# Altium schematic sheet 基础拓扑推导-1.SchDoc
size 1651 x 1651 mm; SheetNumber: 1; SheetTotal: 16
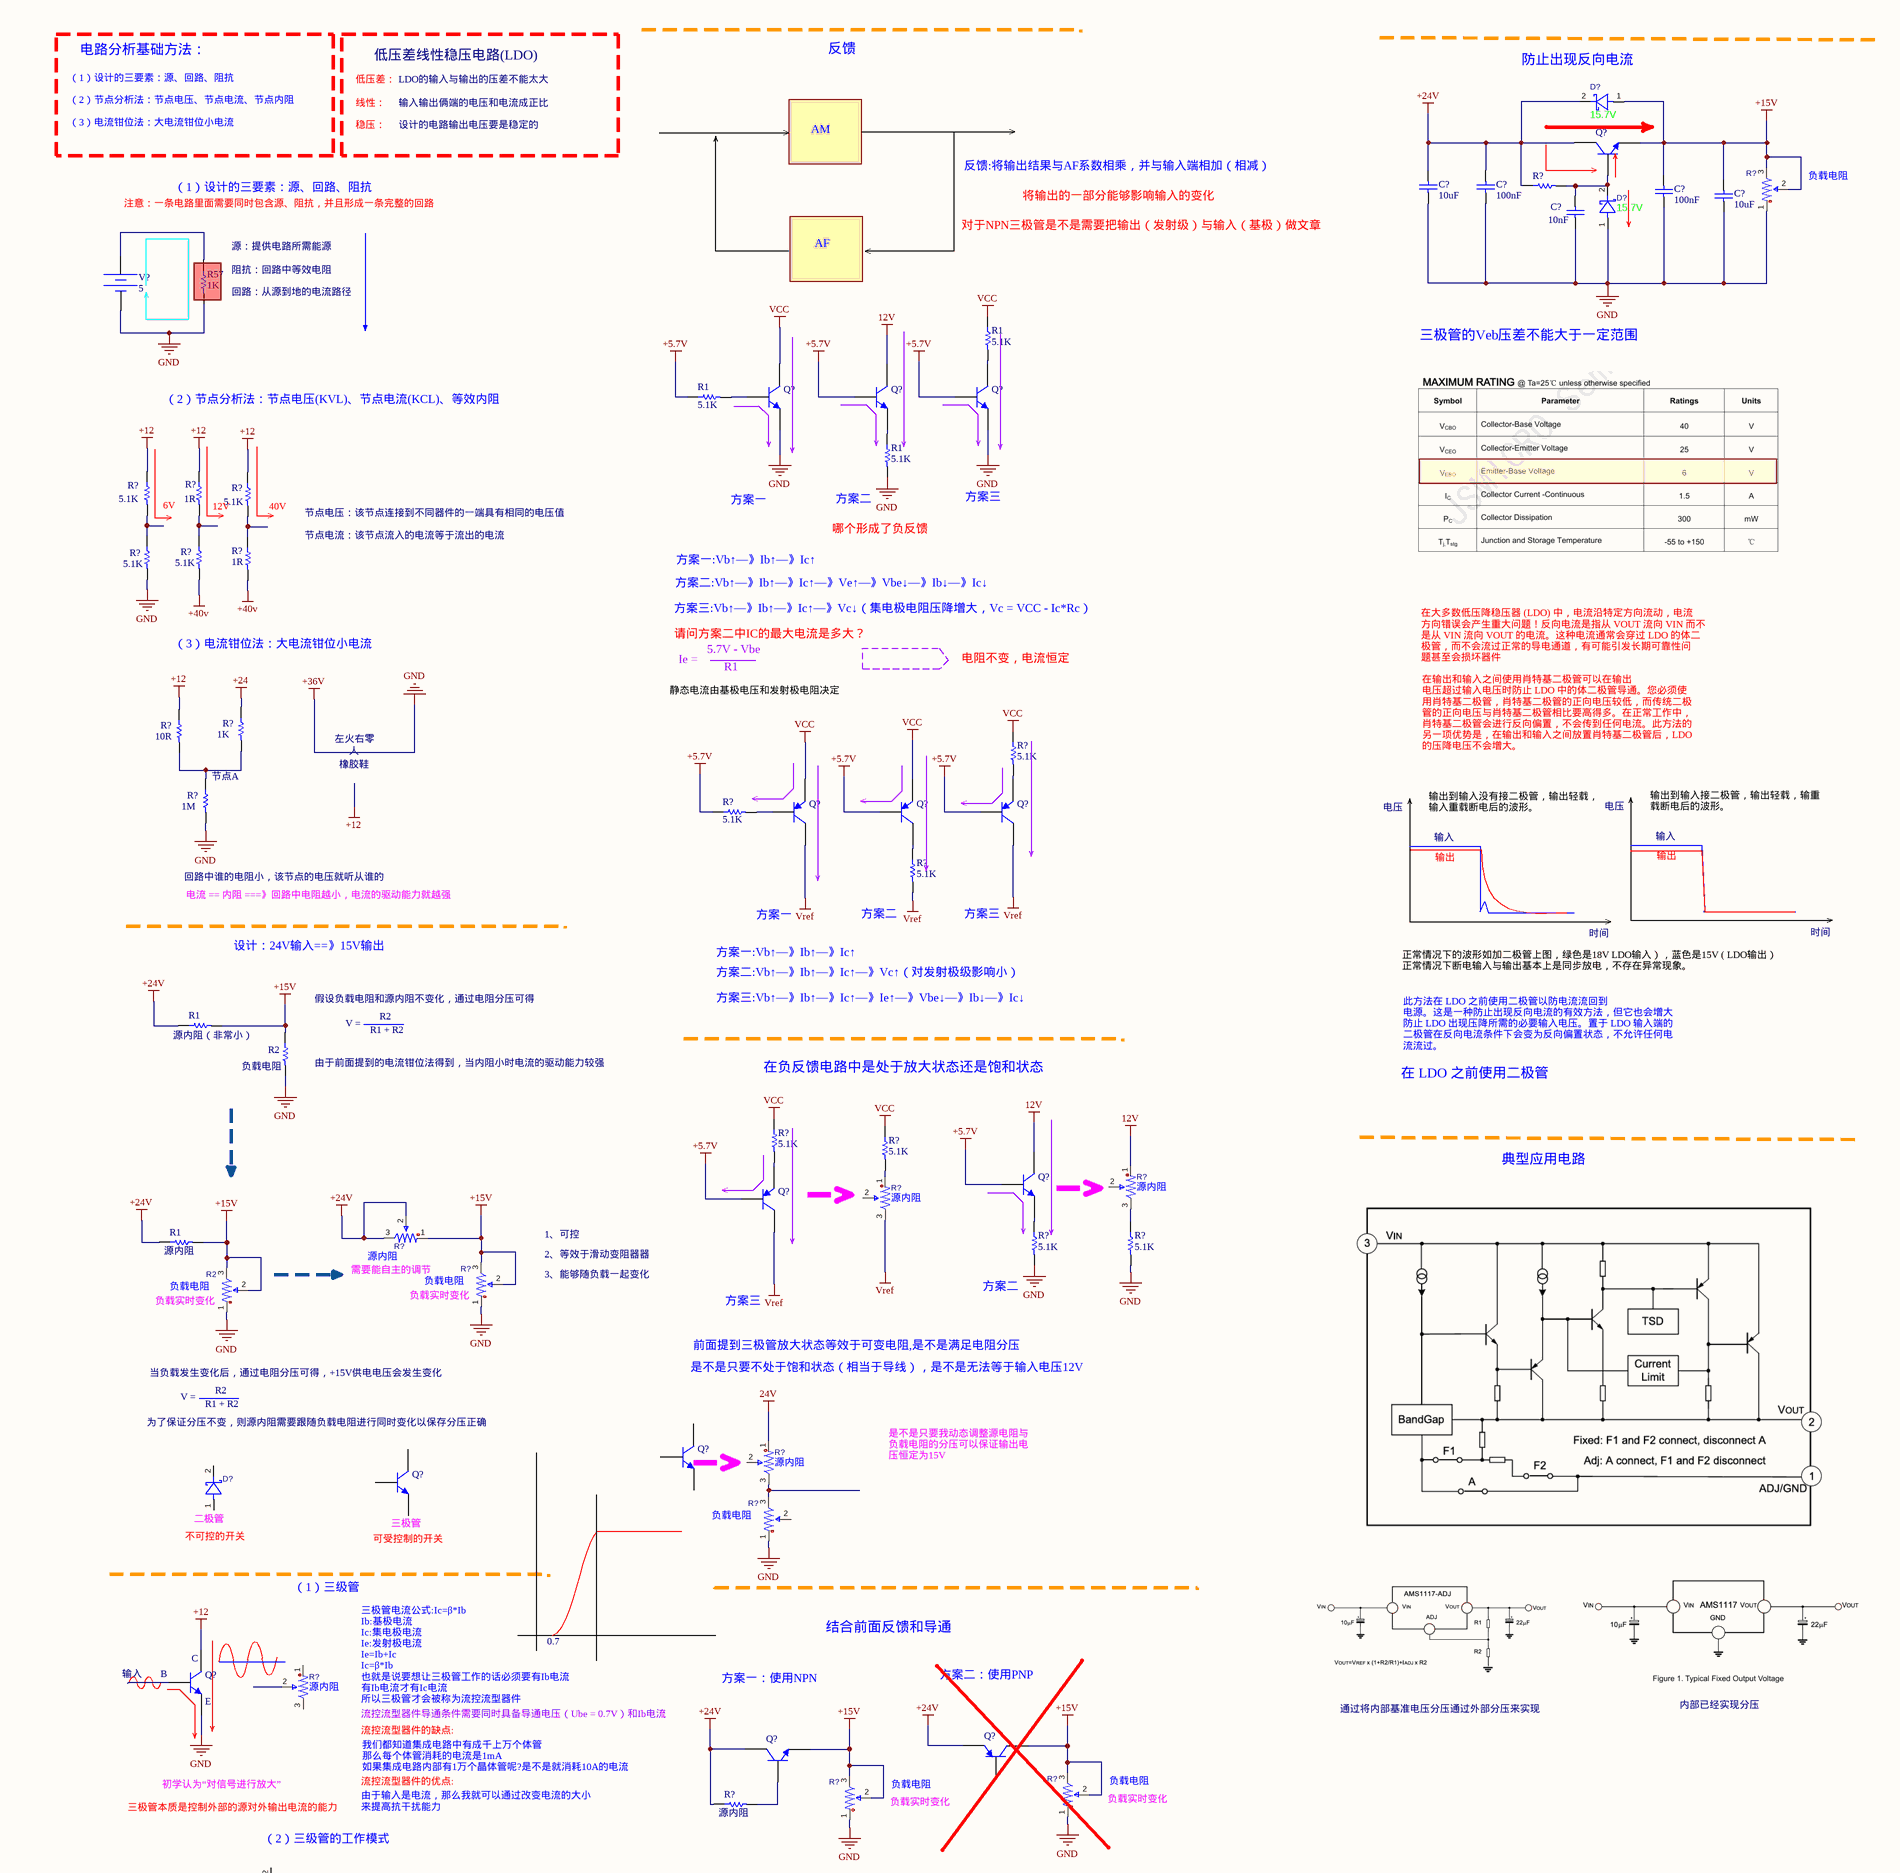
[diagram p0: 基础拓扑推导-1.SchDoc, top left]
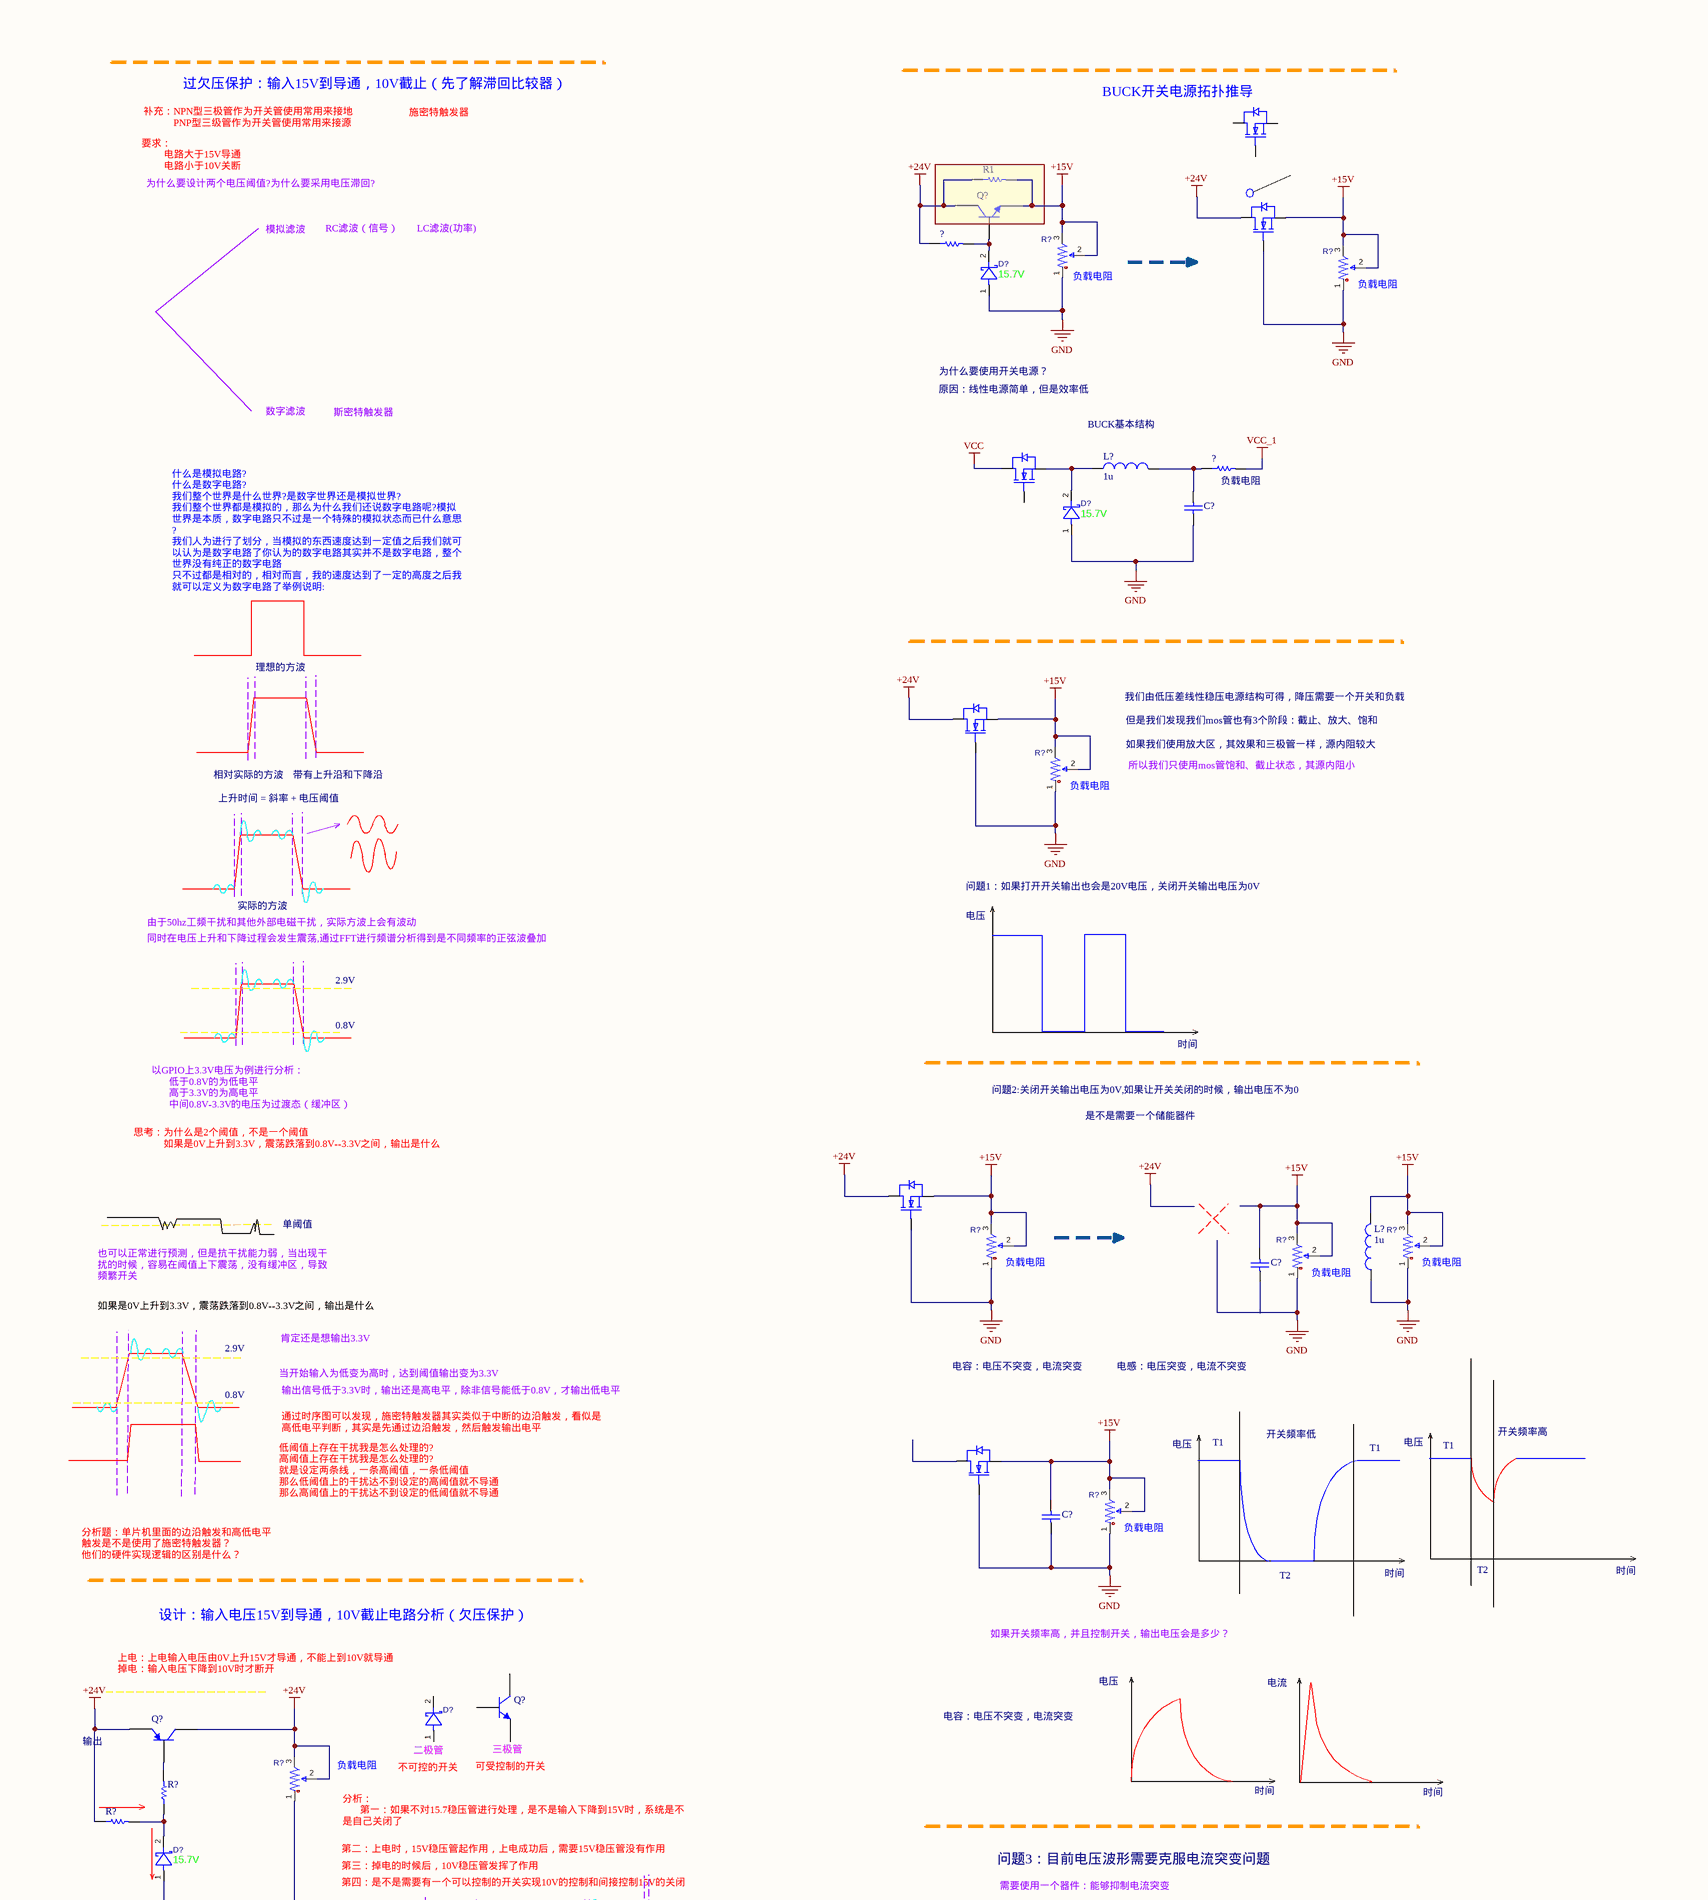
[diagram p1: 基础拓扑推导-1.SchDoc, top middle]
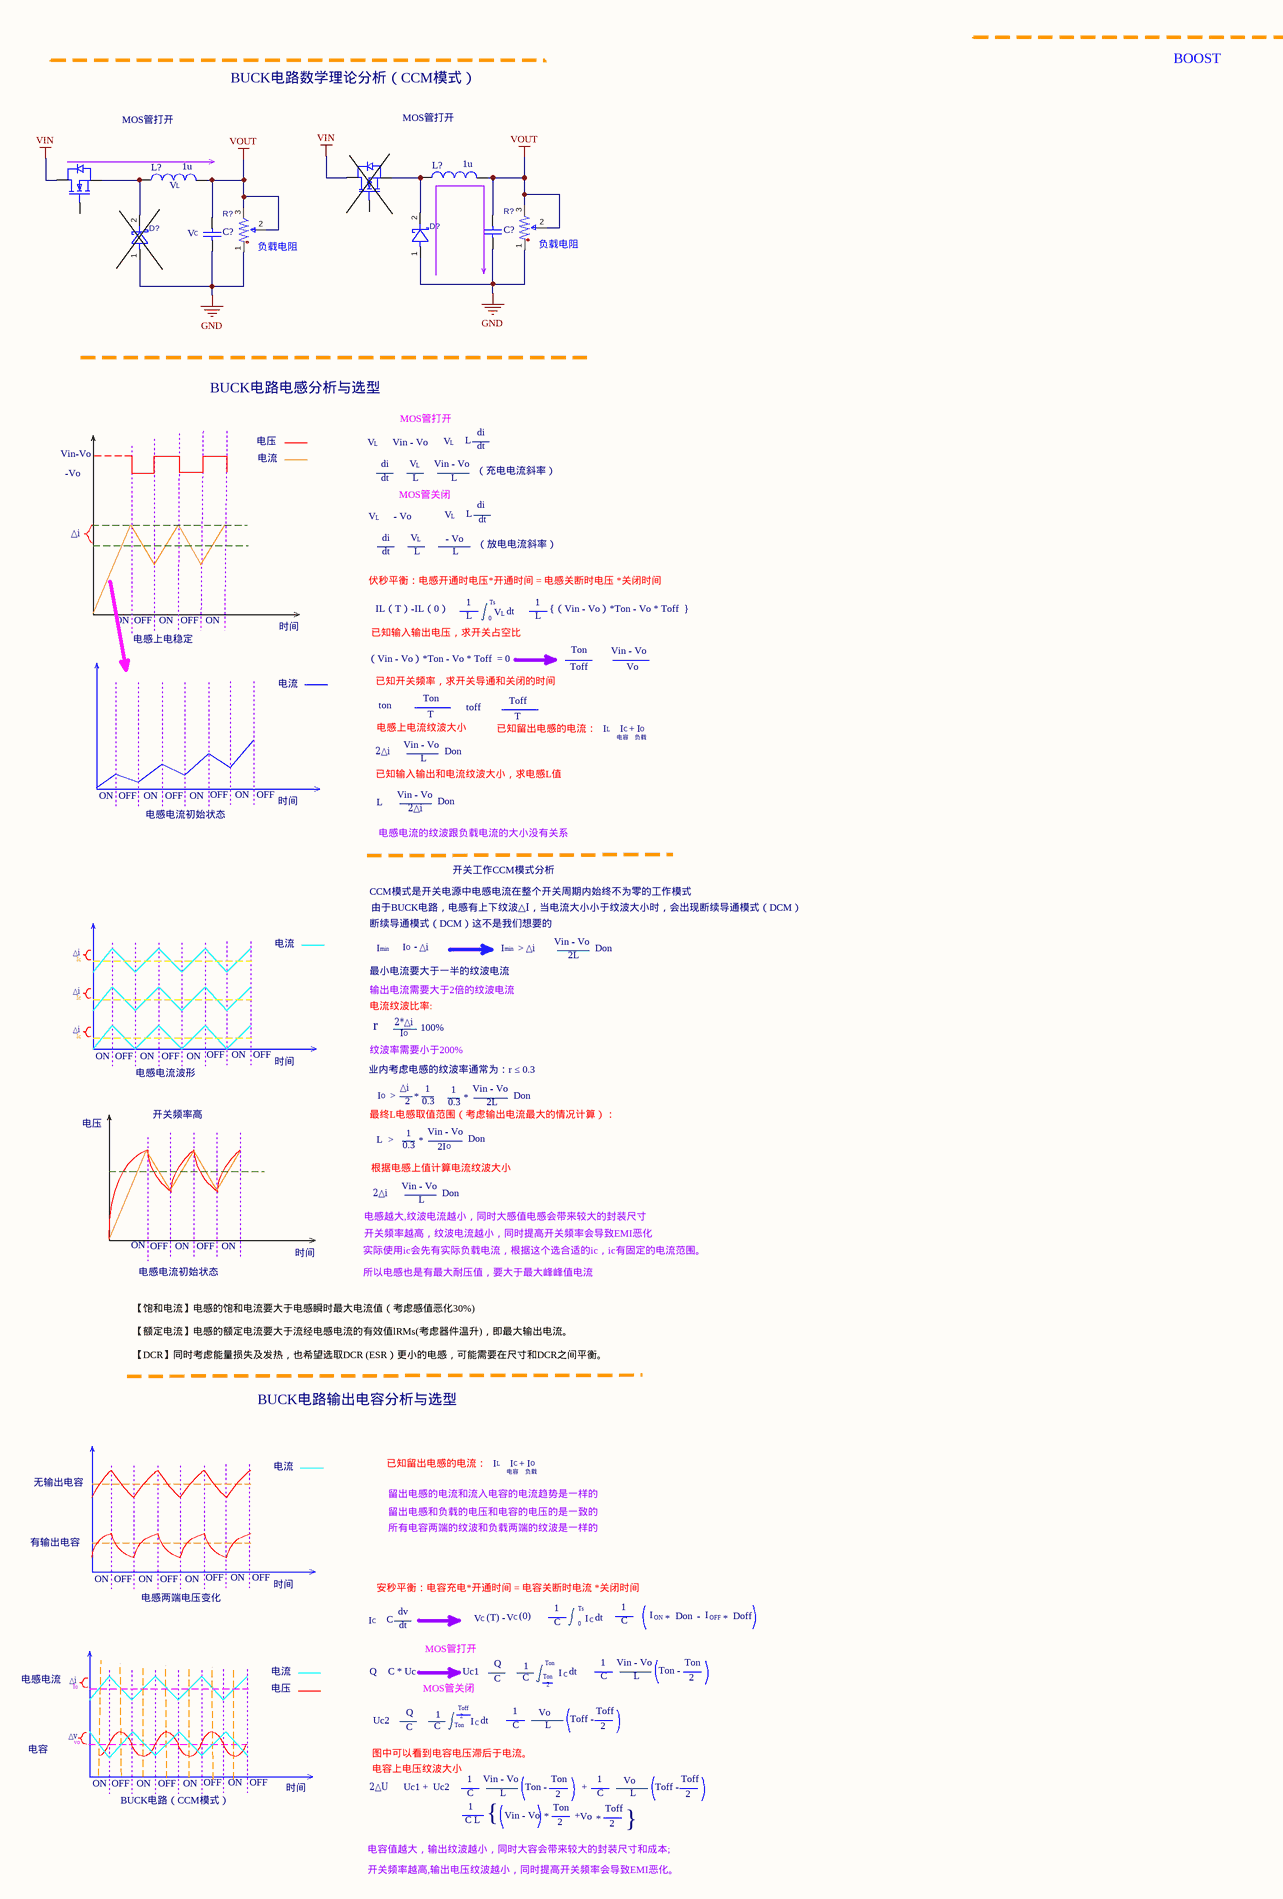
[diagram p2: 基础拓扑推导-1.SchDoc, top right]
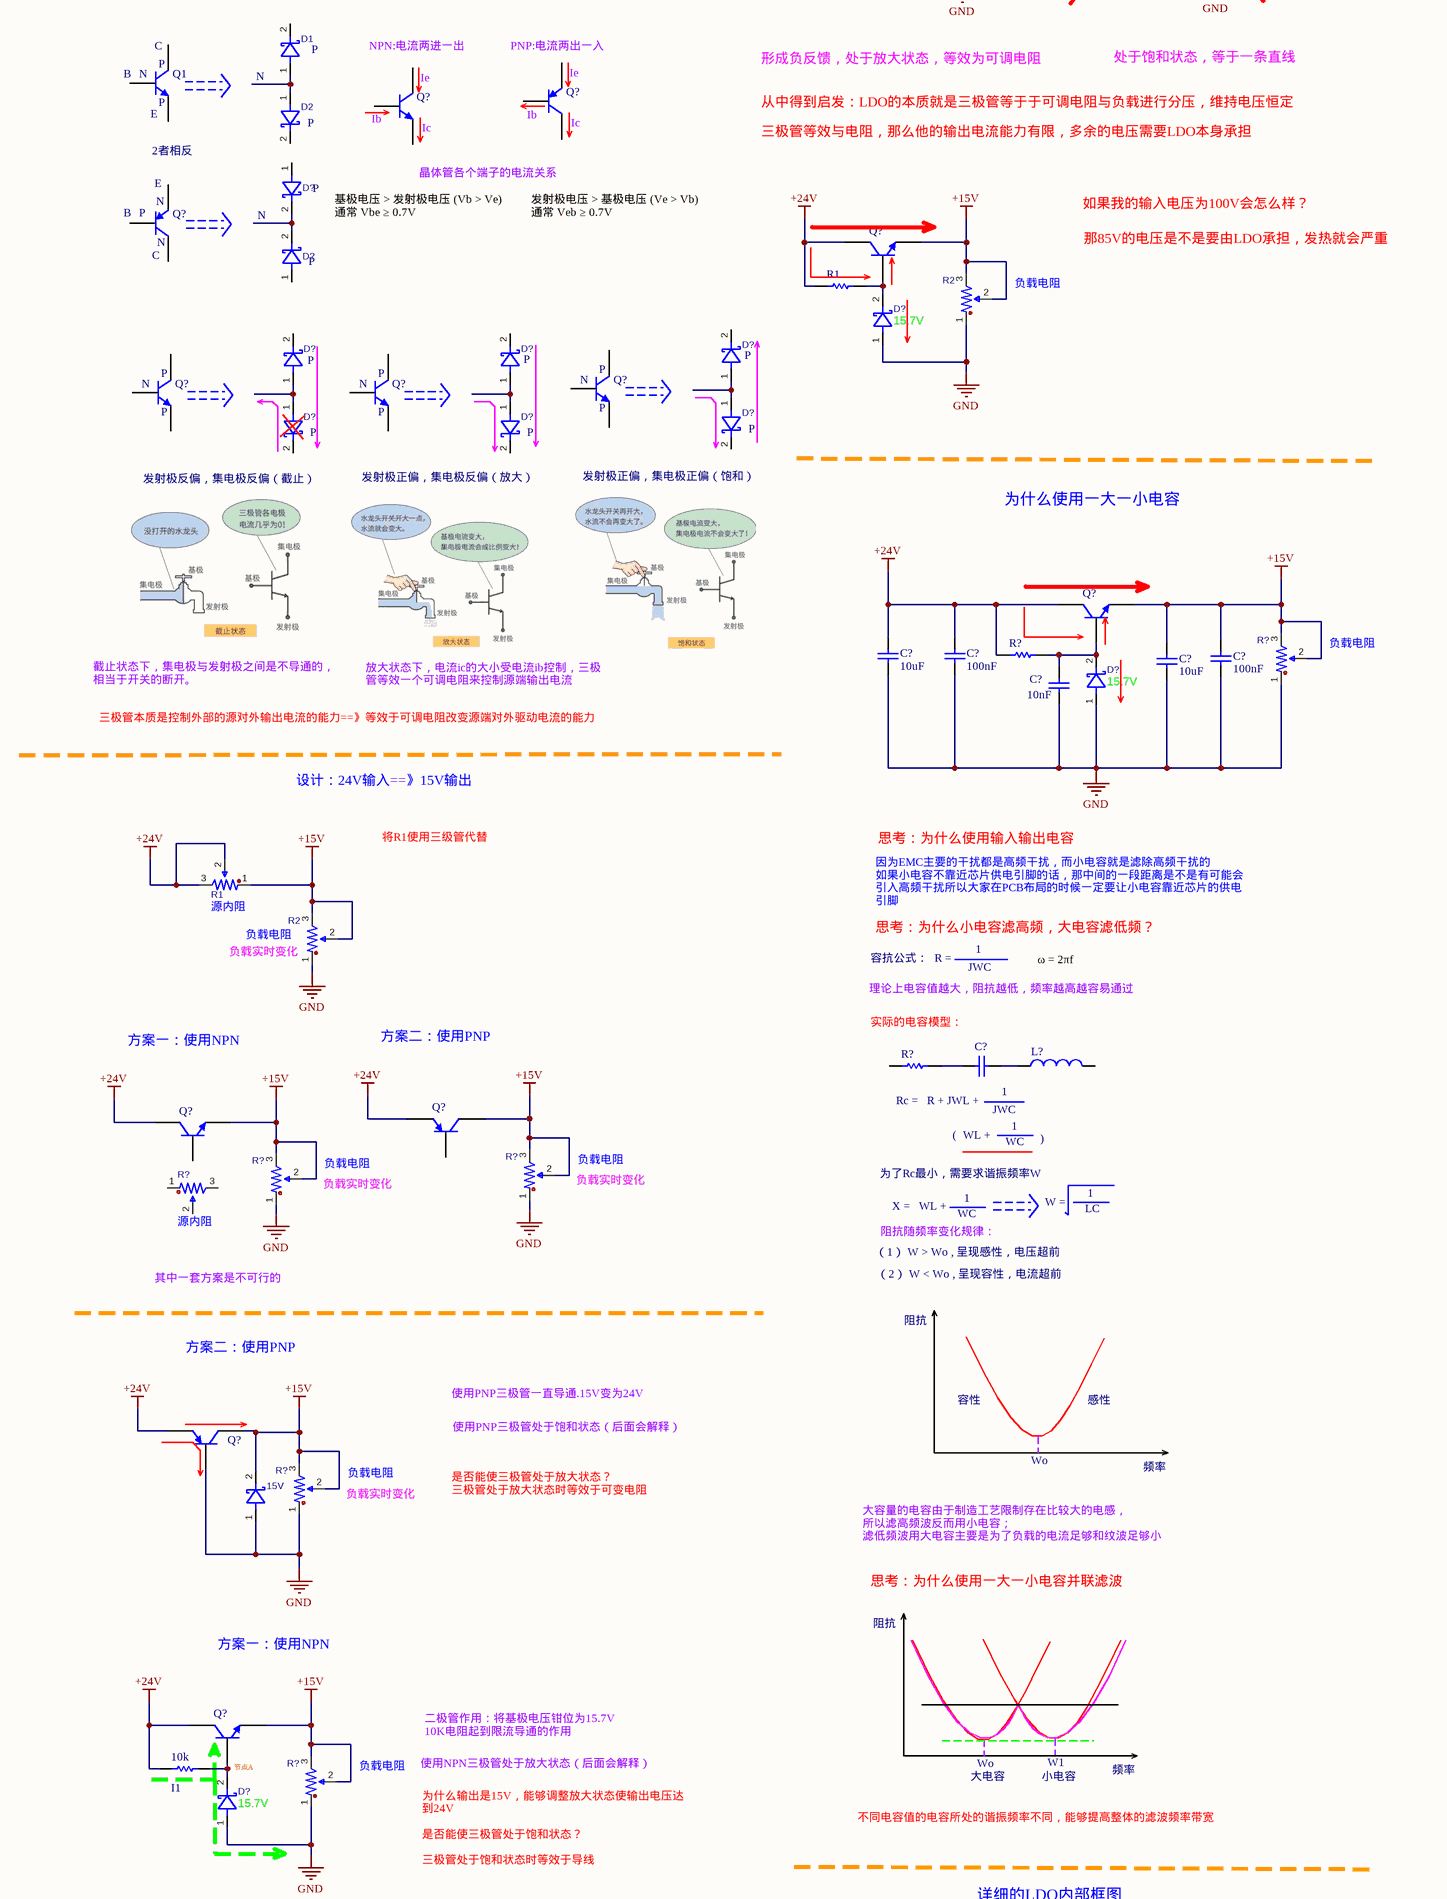
[diagram p3: 基础拓扑推导-1.SchDoc, centre left]
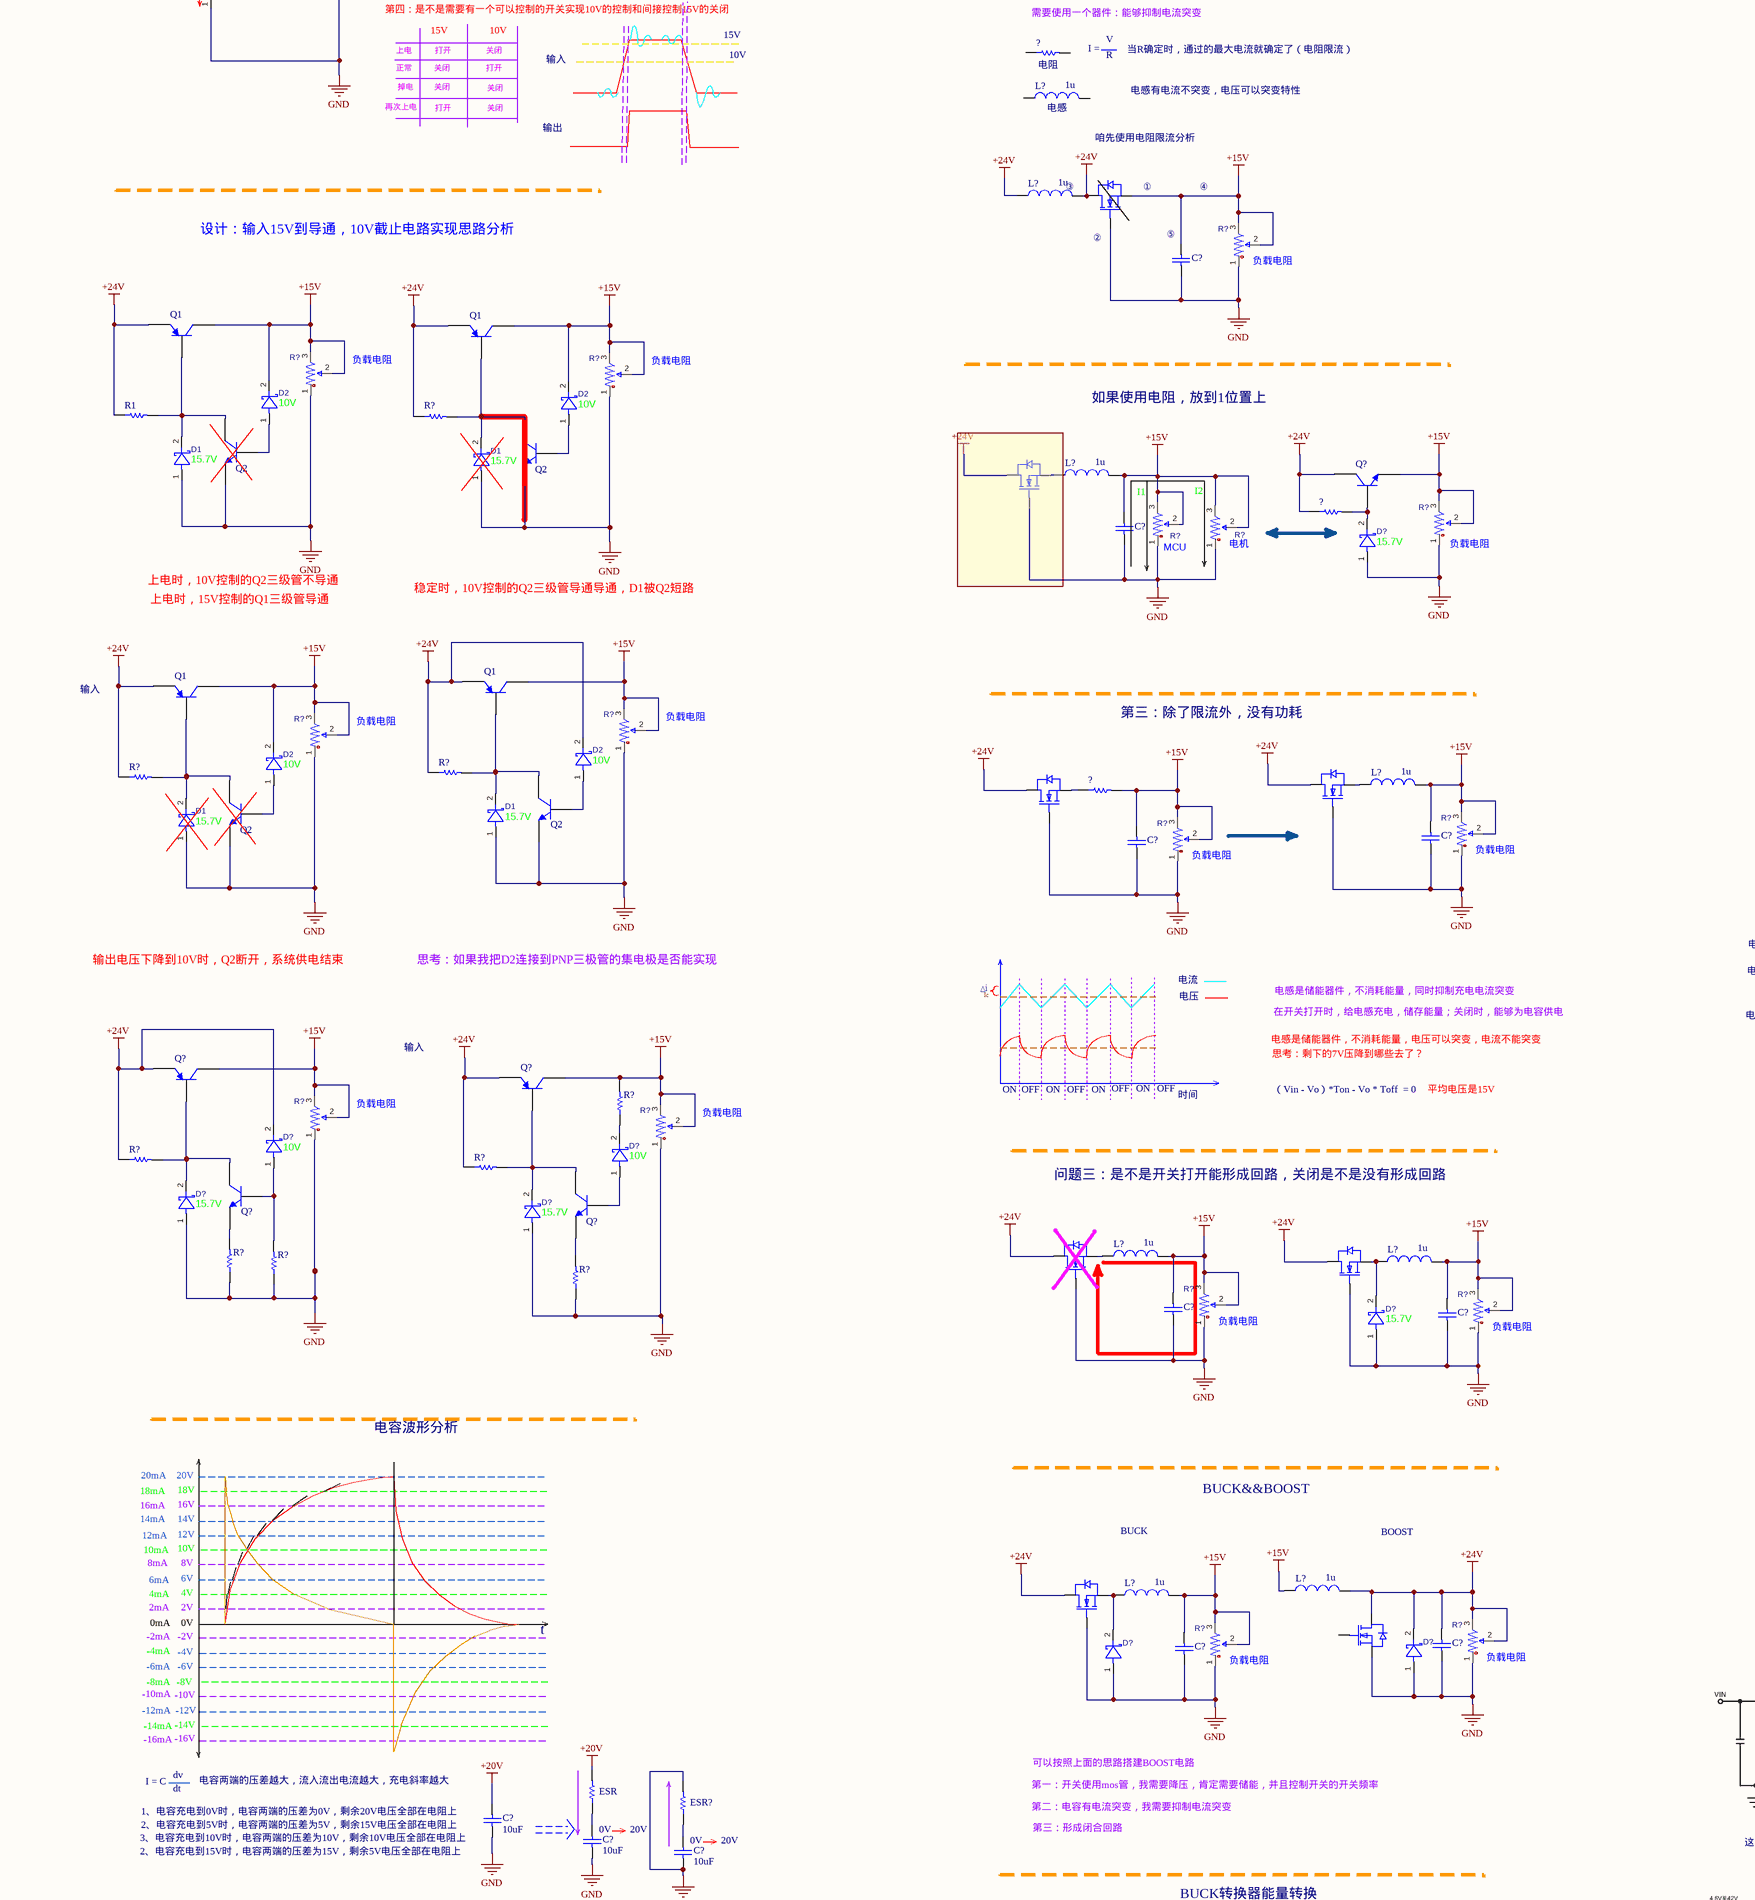
[diagram p4: 基础拓扑推导-1.SchDoc, centre middle]
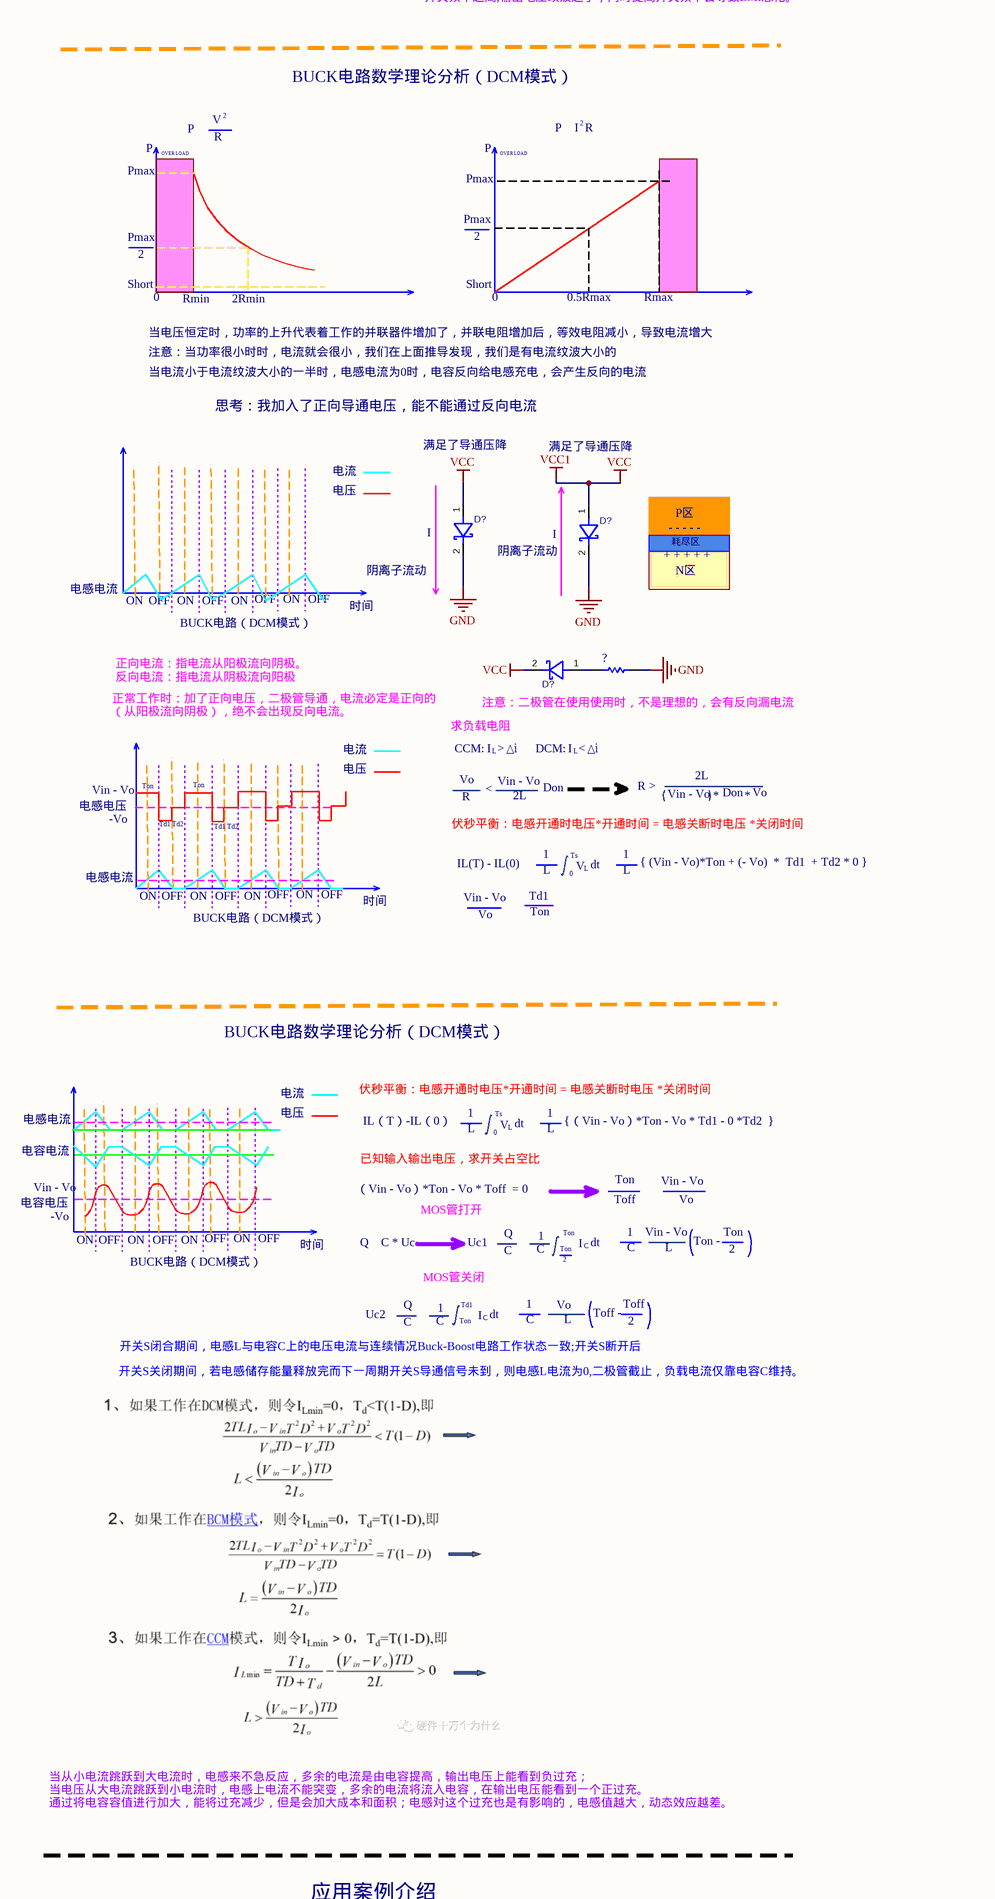
[diagram p5: 基础拓扑推导-1.SchDoc, centre right]
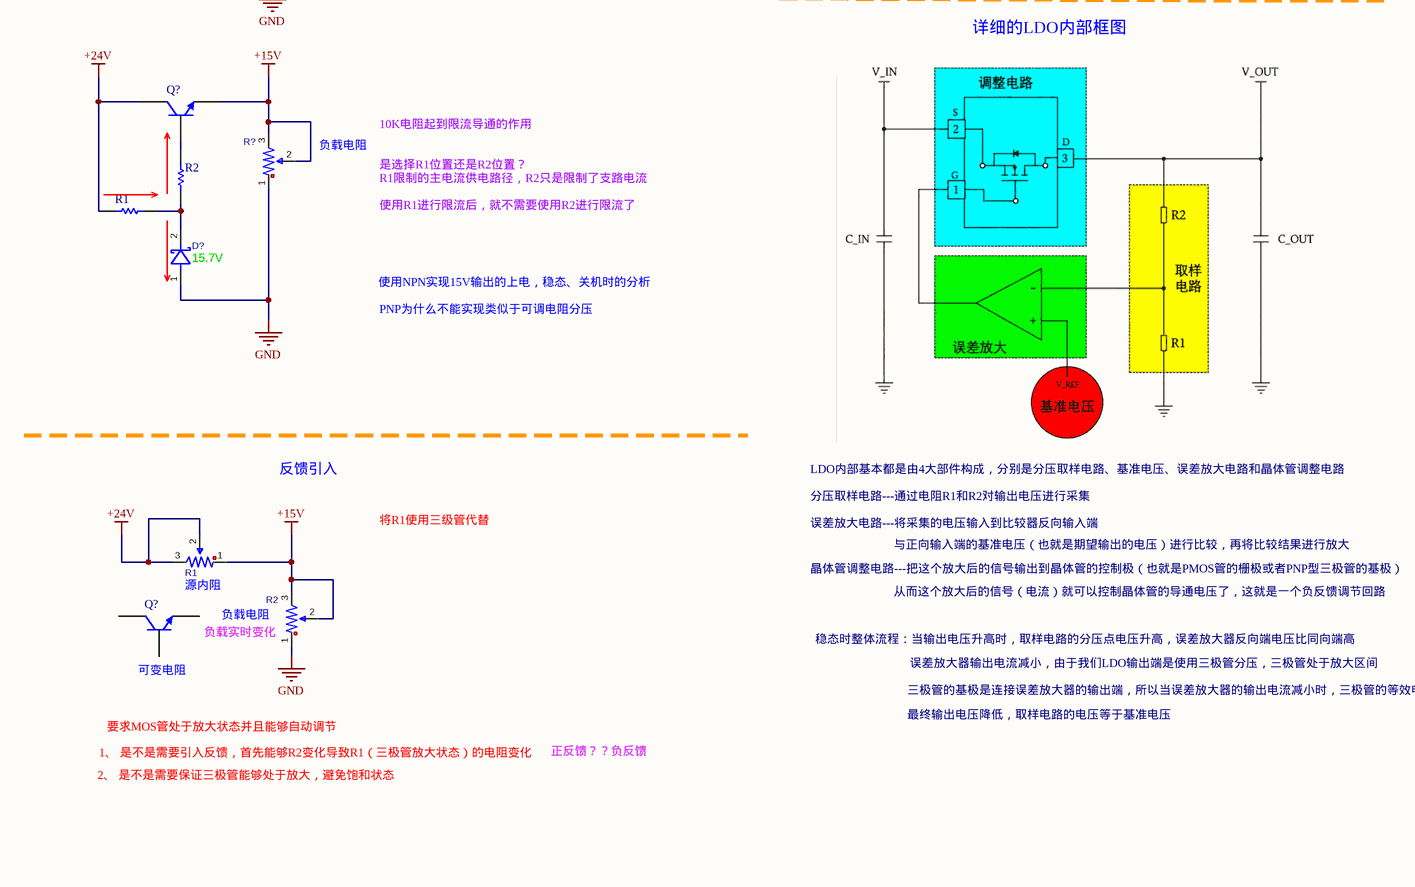
[diagram p6: 基础拓扑推导-1.SchDoc, bottom left]
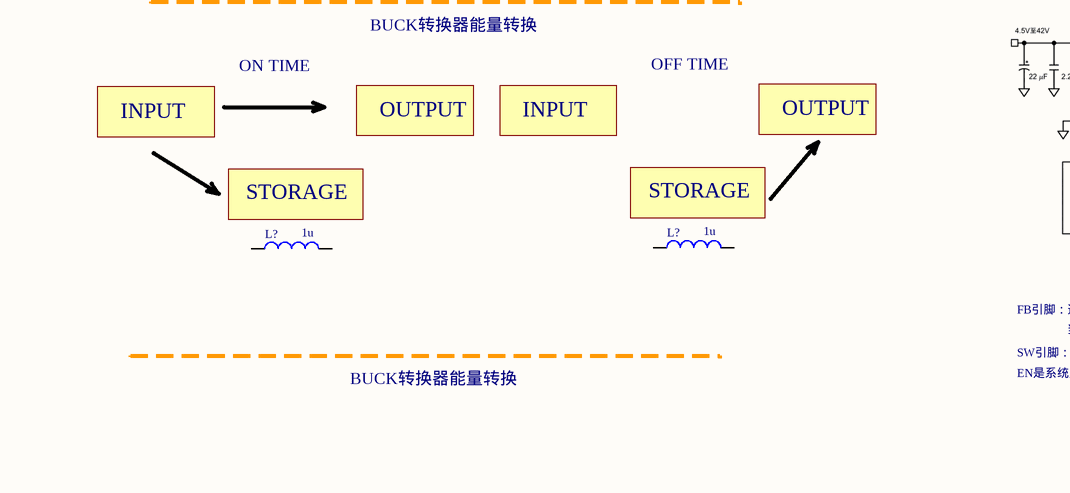
[diagram p7: 基础拓扑推导-1.SchDoc, bottom middle]
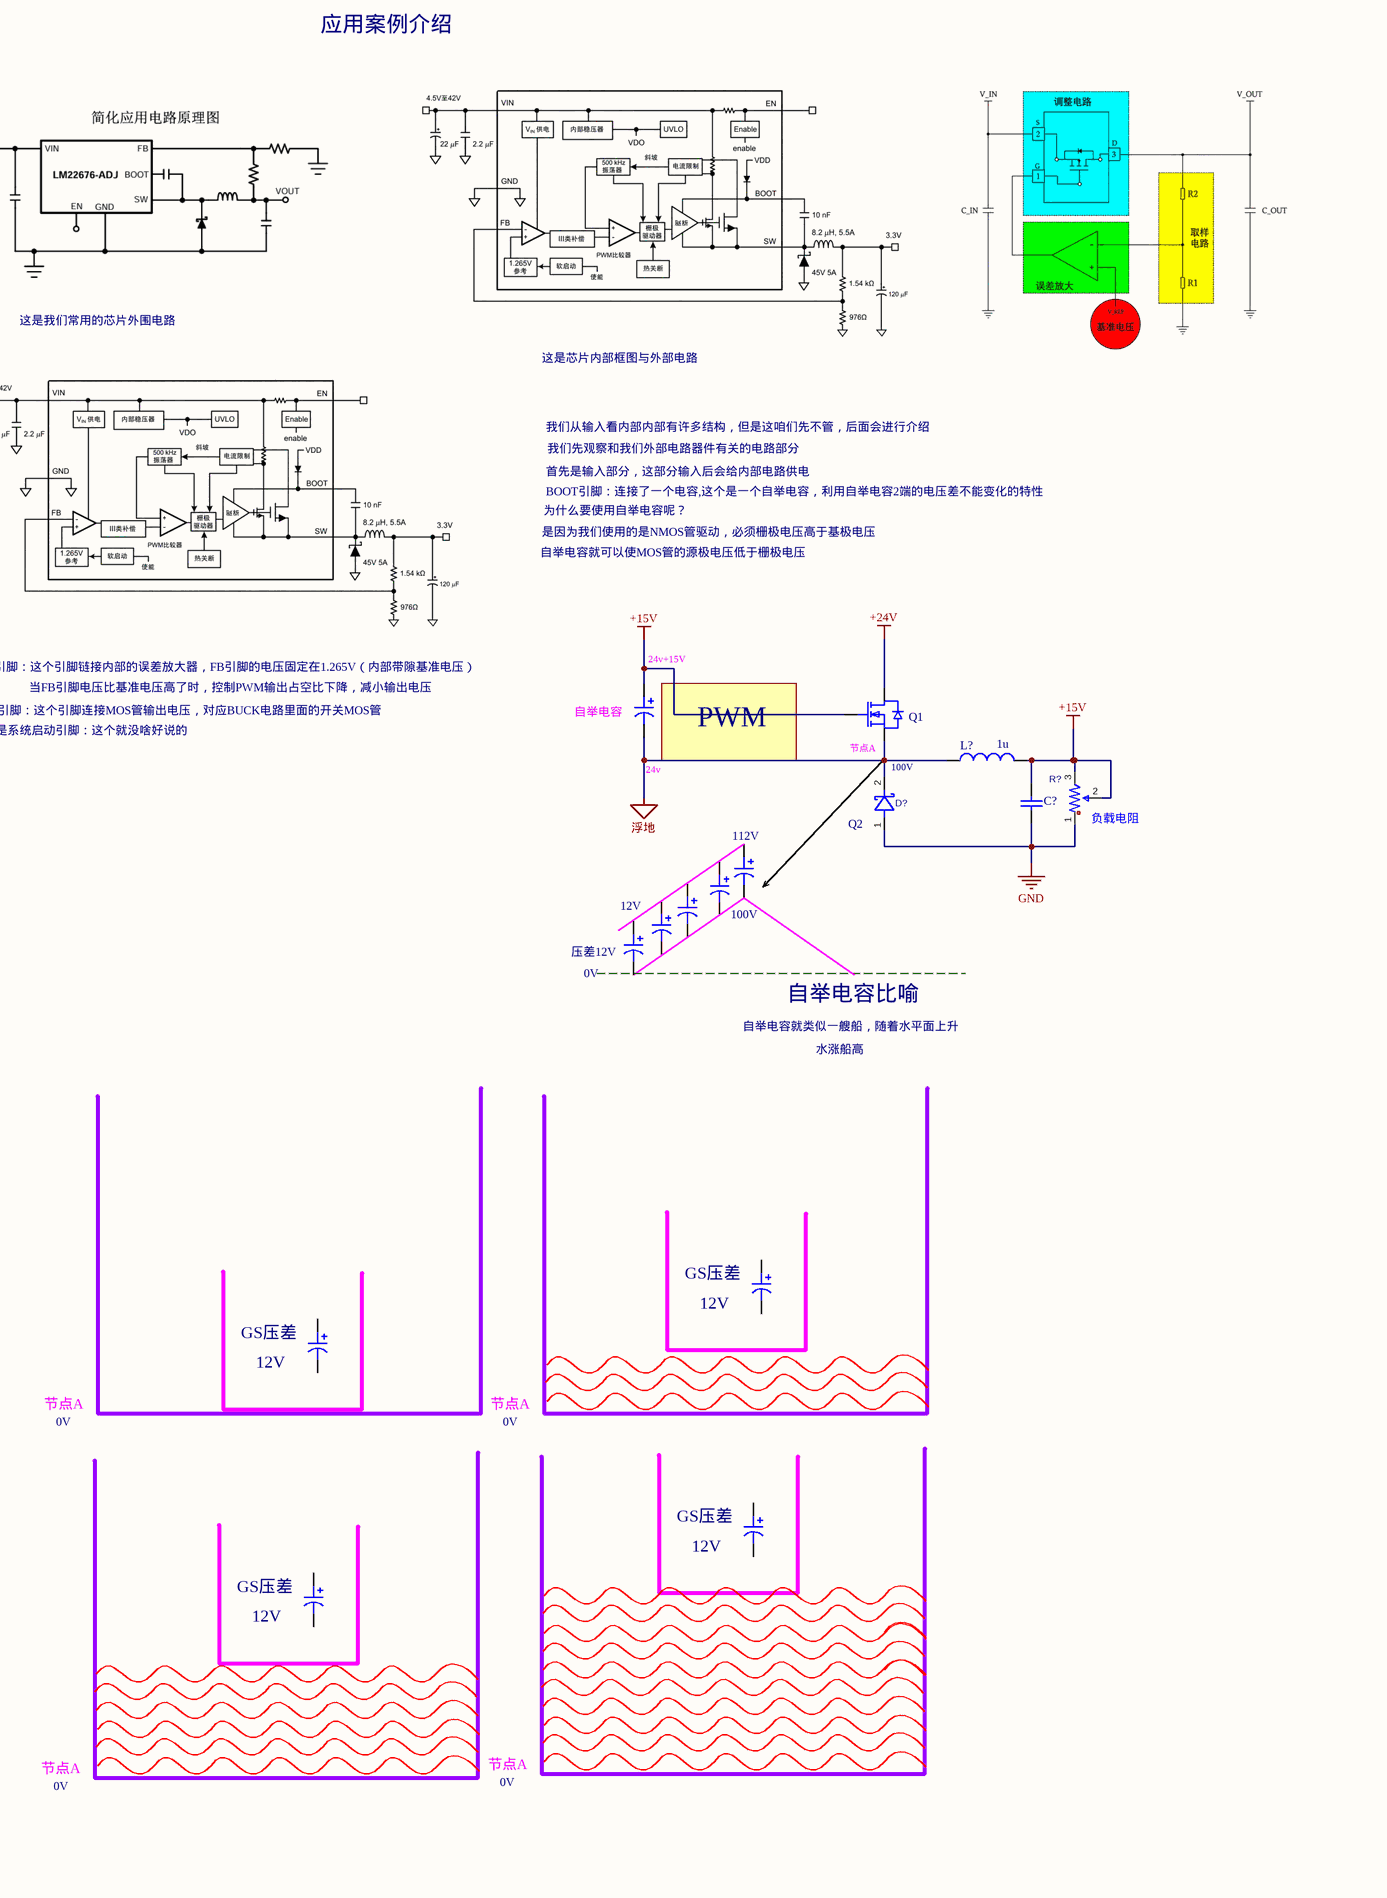
[diagram p8: 基础拓扑推导-1.SchDoc, bottom right]

## Parts
(Parts that share a designator on the sheet are numbered #1, #2 ... from top to bottom, then left to right.)
10k  Resistor  (value not drawn)
15V  1N4148W_C7420318  (value not drawn)
?#1  Resistor  (value not drawn)
?#2  Resistor  (value not drawn)
?#3  Resistor  (value not drawn)
?#4  Resistor  (value not drawn)
?#5  Resistor  (value not drawn)
?#6  Resistor  (value not drawn)
C?#1  value 100nF  (hidden comment: Capacitor)
C?#2  value 10uF  (hidden comment: Capacitor)
C?#3  value 10nF  (hidden comment: Capacitor)
C?#4  value 10uF  (hidden comment: Capacitor)
C?#5  value 100nF  (hidden comment: Capacitor)
C?#6  Capacitor  (value not drawn)
C?#7  Capacitor  (value not drawn)
C?#8  Capacitor  (value not drawn)
C?#9  Capacitor  (value not drawn)
C?#10  Capacitor  (value not drawn)
C?#11  Capacitor  (value not drawn)
C?#12  Capacitor  (value not drawn)
C?#13  value 100nF  (hidden comment: Capacitor)
C?#14  value 10uF  (hidden comment: Capacitor)
C?#15  value 10nF  (hidden comment: Capacitor)
C?#16  value 10uF  (hidden comment: Capacitor)
C?#17  value 100nF  (hidden comment: Capacitor)
C?#18  Capacitor  (value not drawn)
C?#19  Capacitor  (value not drawn)
C?#20  Capacitor  (value not drawn)
C?#21  Capacitor  (value not drawn)
C?#22  Capacitor  (value not drawn)
C?#23  Capacitor  (value not drawn)
C?#24  Capacitor  (value not drawn)
C?#25  value 10uF  (hidden comment: Capacitor)
C?#26  value 10uF  (hidden comment: Capacitor)
C?#27  value 10uF  (hidden comment: Capacitor)
C?#28  JVJ50V100M6X8  (value not drawn)
C?#29  Capacitor  (value not drawn)
C?#30  JVJ50V100M6X8  (value not drawn)
C?#31  JVJ50V100M6X8  (value not drawn)
C?#32  JVJ50V100M6X8  (value not drawn)
C?#33  JVJ50V100M6X8  (value not drawn)
C?#34  JVJ50V100M6X8  (value not drawn)
C?#35  JVJ50V100M6X8  (value not drawn)
C?#36  JVJ50V100M6X8  (value not drawn)
C?#37  JVJ50V100M6X8  (value not drawn)
C?#38  JVJ50V100M6X8  (value not drawn)
D1#1  1N4148W_C7420318  (value not drawn)
D1#2  15.7V
D1#3  15.7V
D1#4  15.7V
D1#5  15.7V
D2#1  1N4148W_C7420318  (value not drawn)
D2#2  10V
D2#3  10V
D2#4  10V
D2#5  10V
D?#1  15.7V
D?#2  15.7V
D?#3  15V  (value not drawn)
D?#4  15V  (value not drawn)
D?#5  15.7V
D?#6  15.7V
D?#7  1N4148W_C7420318  (value not drawn)
D?#8  1N4148W_C7420318  (value not drawn)
D?#9  15.7V
D?#10  1N4148W_C7420318  (value not drawn)
D?#11  1N4148W_C7420318  (value not drawn)
D?#12  15.7V
D?#13  1N4148W_C7420318  (value not drawn)
D?#14  1N4148W_C7420318  (value not drawn)
D?#15  1N4148W_C7420318  (value not drawn)
D?#16  1N4148W_C7420318  (value not drawn)
D?#17  1N4148W_C7420318  (value not drawn)
D?#18  1N4148W_C7420318  (value not drawn)
D?#19  15.7V  (value not drawn)
D?#20  15.7V  (value not drawn)
D?#21  15.7V
D?#22  15.7V  (value not drawn)
D?#23  15.7V
D?#24  10V
D?#25  10V
D?#26  15.7V
D?#27  15.7V
D?#28  15.7V
D?#29  15.7V
D?#30  15V  (value not drawn)
D?#31  15V  (value not drawn)
D?#32  15.7V
D?#33  15V  (value not drawn)
ESR  Resistor  (value not drawn)
ESR?  Resistor  (value not drawn)
L?#1  value 1u  (hidden comment: Inductor)
L?#2  value 1u  (hidden comment: Inductor)
L?#3  value 1u  (hidden comment: Inductor)
L?#4  value 1u  (hidden comment: Inductor)
L?#5  value 1u  (hidden comment: Inductor)
L?#6  value 1u  (hidden comment: Inductor)
L?#7  value 1u  (hidden comment: Inductor)
L?#8  value 1u  (hidden comment: Inductor)
L?#9  Inductor  (value not drawn)
L?#10  value 1u  (hidden comment: Inductor)
L?#11  value 1u  (hidden comment: Inductor)
L?#12  value 1u  (hidden comment: Inductor)
L?#13  value 1u  (hidden comment: Inductor)
L?#14  value 1u  (hidden comment: Inductor)
L?#15  value 1u  (hidden comment: Inductor)
L?#16  value 1u  (hidden comment: Inductor)
Q1#1  Bipolar NPN 3 Pins Transistor VBIC Model  (value not drawn)
Q1#2  Bipolar PNP 3 Pins Transistor Gummel-Poon Model  (value not drawn)
Q1#3  Bipolar PNP 3 Pins Transistor Gummel-Poon Model  (value not drawn)
Q1#4  Bipolar PNP 3 Pins Transistor Gummel-Poon Model  (value not drawn)
Q1#5  Bipolar PNP 3 Pins Transistor Gummel-Poon Model  (value not drawn)
Q2#1  Bipolar NPN 3 Pins Transistor VBIC Model  (value not drawn)
Q2#2  Bipolar NPN 3 Pins Transistor VBIC Model  (value not drawn)
Q2#3  Bipolar NPN 3 Pins Transistor VBIC Model  (value not drawn)
Q2#4  Bipolar NPN 3 Pins Transistor VBIC Model  (value not drawn)
Q?#1  2N7002,215  (value not drawn)
Q?#2  Bipolar NPN 3 Pins Transistor VBIC Model  (value not drawn)
Q?#3  2N7002,215  (value not drawn)
Q?#4  2N7002,215  (value not drawn)
Q?#5  Bipolar NPN 3 Pins Transistor VBIC Model  (value not drawn)
Q?#6  Bipolar NPN 3 Pins Transistor VBIC Model  (value not drawn)
Q?#7  Bipolar NPN 3 Pins Transistor VBIC Model  (value not drawn)
Q?#8  Bipolar NPN 3 Pins Transistor VBIC Model  (value not drawn)
Q?#9  2N7002,215  (value not drawn)
Q?#10  2N7002,215  (value not drawn)
Q?#11  Bipolar PNP 3 Pins Transistor Gummel-Poon Model  (value not drawn)
Q?#12  Bipolar PNP 3 Pins Transistor Gummel-Poon Model  (value not drawn)
Q?#13  Bipolar PNP 3 Pins Transistor Gummel-Poon Model  (value not drawn)
Q?#14  Bipolar NPN 3 Pins Transistor VBIC Model  (value not drawn)
Q?#15  2N7002,215  (value not drawn)
Q?#16  Bipolar PNP 3 Pins Transistor Gummel-Poon Model  (value not drawn)
Q?#17  2N7002,215  (value not drawn)
Q?#18  Bipolar NPN 3 Pins Transistor VBIC Model  (value not drawn)
Q?#19  Bipolar NPN 3 Pins Transistor VBIC Model  (value not drawn)
Q?#20  Bipolar NPN 3 Pins Transistor VBIC Model  (value not drawn)
Q?#21  Bipolar NPN 3 Pins Transistor VBIC Model  (value not drawn)
Q?#22  Bipolar PNP 3 Pins Transistor Gummel-Poon Model  (value not drawn)
Q?#23  Bipolar PNP 3 Pins Transistor Gummel-Poon Model  (value not drawn)
Q?#24  Bipolar NPN 3 Pins Transistor VBIC Model  (value not drawn)
Q?#25  Bipolar PNP 3 Pins Transistor Gummel-Poon Model  (value not drawn)
Q?#26  Bipolar NPN 3 Pins Transistor VBIC Model  (value not drawn)
Q?#27  Bipolar PNP 3 Pins Transistor Gummel-Poon Model  (value not drawn)
Q?#28  2N7002,215  (value not drawn)
Q?#29  Bipolar NPN 3 Pins Transistor VBIC Model  (value not drawn)
Q?#30  Bipolar NPN 3 Pins Transistor VBIC Model  (value not drawn)
Q?#31  Bipolar NPN 3 Pins Transistor VBIC Model  (value not drawn)
Q?#32  Bipolar NPN 3 Pins Transistor VBIC Model  (value not drawn)
Q?#33  2N7002,215  (value not drawn)
Q?#34  Bipolar NPN 3 Pins Transistor VBIC Model  (value not drawn)
Q?#35  Bipolar NPN 3 Pins Transistor VBIC Model  (value not drawn)
Q?#36  2N7002,215  (value not drawn)
Q?#37  2N7002,215  (value not drawn)
Q?#38  Bipolar NPN 3 Pins Transistor VBIC Model  (value not drawn)
Q?#39  Bipolar PNP 3 Pins Transistor Gummel-Poon Model  (value not drawn)
Q?#40  Bipolar PNP 3 Pins Transistor Gummel-Poon Model  (value not drawn)
Q?#41  Bipolar PNP 3 Pins Transistor Gummel-Poon Model  (value not drawn)
Q?#42  Bipolar NPN 3 Pins Transistor VBIC Model  (value not drawn)
Q?#43  Bipolar NPN 3 Pins Transistor VBIC Model  (value not drawn)
Q?#44  2N7002,215  (value not drawn)
Q?#45  2N7002,215  (value not drawn)
Q?#46  Bipolar PNP 3 Pins Transistor Gummel-Poon Model  (value not drawn)
Q?#47  Bipolar NPN 3 Pins Transistor VBIC Model  (value not drawn)
Q?#48  2N7002,215  (value not drawn)
Q?#49  2N7002,215  (value not drawn)
Q?#50  Bipolar NPN 3 Pins Transistor VBIC Model  (value not drawn)
Q?#51  Bipolar NPN 3 Pins Transistor VBIC Model  (value not drawn)
Q?#52  2N7002,215  (value not drawn)
Q??  2N7002,215  (value not drawn)
R1#1  Resistor  (value not drawn)
R1#2  value 5.1K  (hidden comment: Resistor)
R1#3  value 5.1K  (hidden comment: Resistor)
R1#4  value 5.1K  (hidden comment: Resistor)
R1#5  value 源内阻（非常小）  (hidden comment: Resistor)
R1#6  value 源内阻  (hidden comment: Resistor)
R1#7  Resistor  (value not drawn)
R1#8  Resistor  (value not drawn)
R1#9  源内阻
R1#10  Resistor  (value not drawn)
R1#11  源内阻
R2#1  value 负载电阻  (hidden comment: Resistor)
R2#2  负载电阻
R2#3  负载电阻
R2#4  负载电阻
R2#5  Resistor  (value not drawn)
R2#6  负载电阻
R57  value 1K  (hidden comment: Resistor)
R?#1  Resistor  (value not drawn)
R?#2  负载电阻
R?#3  负载电阻
R?#4  负载电阻
R?#5  负载电阻
R?#6  负载电阻
R?#7  value 5.1K  (hidden comment: Resistor)
R?#8  value 1R  (hidden comment: Resistor)
R?#9  value 5.1K  (hidden comment: Resistor)
R?#10  value 5.1K  (hidden comment: Resistor)
R?#11  value 5.1K  (hidden comment: Resistor)
R?#12  value 1R  (hidden comment: Resistor)
R?#13  value 10R  (hidden comment: Resistor)
R?#14  value 1K  (hidden comment: Resistor)
R?#15  value 5.1K  (hidden comment: Resistor)
R?#16  负载电阻
R?#17  value 1M  (hidden comment: Resistor)
R?#18  value 5.1K  (hidden comment: Resistor)
R?#19  value 5.1K  (hidden comment: Resistor)
R?#20  value 5.1K  (hidden comment: Resistor)
R?#21  value 5.1K  (hidden comment: Resistor)
R?#22  源内阻
R?#23  源内阻
R?#24  value 5.1K  (hidden comment: Resistor)
R?#25  value 5.1K  (hidden comment: Resistor)
R?#26  负载电阻
R?#27  负载电阻
R?#28  负载电阻
R?#29  源内阻
R?#30  负载电阻
R?#31  源内阻
R?#32  负载电阻
R?#33  负载电阻
R?#34  源内阻
R?#35  负载电阻
R?#36  Resistor  (value not drawn)
R?#37  Resistor  (value not drawn)
R?#38  负载电阻
R?#39  负载电阻
R?#40  value 源内阻  (hidden comment: Resistor)
R?#41  负载电阻
R?#42  负载电阻
R?#43  负载电阻
R?#44  Resistor  (value not drawn)
R?#45  MCU
R?#46  负载电阻
R?#47  电机
R?#48  Resistor  (value not drawn)
R?#49  负载电阻
R?#50  负载电阻
R?#51  负载电阻
R?#52  Resistor  (value not drawn)
R?#53  Resistor  (value not drawn)
R?#54  负载电阻
R?#55  负载电阻
R?#56  Resistor  (value not drawn)
R?#57  负载电阻
R?#58  负载电阻
R?#59  源内阻
R?#60  负载电阻
R?#61  Resistor  (value not drawn)
R?#62  负载电阻
R?#63  Resistor  (value not drawn)
R?#64  Resistor  (value not drawn)
R?#65  Resistor  (value not drawn)
R?#66  Resistor  (value not drawn)
R?#67  负载电阻
R?#68  Resistor  (value not drawn)
R?#69  负载电阻
R?#70  负载电阻
R?#71  负载电阻
R?#72  负载电阻
R?#73  负载电阻
R?#74  负载电阻
R?#75  负载电阻
V?  DC Magnitude: 5  (hidden comment: Constant Voltage Source)

## Nets
12V: Q?#7.1(C) Q?#14.1(C) R?#22.1
24V: R?#31.1
+5.7V: Q?#7.2(B) Q?#8.2(B) Q?#12.2(B) Q?#13.2(B) Q?#14.2(B) Q?#16.2(B) R1#3.1 R?#18.1
+12: Q?#21.1(C) R?#7.1 R?#8.1 R?#9.1 R?#13.1
+15V: 15V.2(K) ?#6.2 C?#1.1 C?#2.1 C?#9.2 C?#10.2 C?#11.2 C?#12.2 C?#13.1 C?#14.1 C?#18.2 C?#19.2 C?#21.2 C?#22.2 C?#24.2 C?#28.1 C?#29.2 D2#2.2(K) D2#3.2(K) D2#4.2(K) D?#1.1(A) L?#4.2 L?#7.2 L?#8.2 L?#10.2 L?#11.2 L?#12.2 L?#13.1 L?#16.2 Q1#2.1(C) Q1#3.1(C) Q1#4.1(C) Q1#5.1(C) Q?#2.3(E) Q?#5.3(E) Q?#10.2(S) Q?#15.2(S) Q?#17.2(S) Q?#23.1(C) Q?#24.3(E) Q?#28.2(S) Q?#29.3(E) Q?#34.3(E) Q?#35.3(E) Q?#38.3(E) Q?#39.1(C) Q?#40.1(C) Q?#41.1(C) Q?#46.1(C) Q?#47.3(E) Q?#50.3(E) Q?#52.1(G) Q??.2(S) R1#1.2 R1#5.2 R1#6.2 R1#9.1 R1#11.1 R2#1.1 R2#2.2 R2#2.3 R2#3.2 R2#3.3 R2#4.2 R2#4.3 R2#6.2 R2#6.3 R?#2.2 R?#2.3 R?#5.2 R?#5.3 R?#6.2 R?#6.3 R?#16.2 R?#16.3 R?#26.2 R?#26.3 R?#27.2 R?#27.3 R?#28.2 R?#28.3 R?#29.1 R?#30.2 R?#30.3 R?#32.2 R?#32.3 R?#38.2 R?#38.3 R?#39.2 R?#39.3 R?#41.2 R?#41.3 R?#42.2 R?#42.3 R?#43.2 R?#43.3 R?#45.2 R?#45.3 R?#46.2 R?#46.3 R?#47.2 R?#47.3 R?#49.2 R?#49.3 R?#50.2 R?#50.3 R?#51.2 R?#51.3 R?#54.2 R?#54.3 R?#55.2 R?#55.3 R?#57.2 R?#57.3 R?#58.2 R?#58.3 R?#60.2 R?#60.3 R?#61.2 R?#62.2 R?#62.3 R?#67.2 R?#67.3 R?#69.2 R?#69.3 R?#70.2 R?#70.3 R?#71.2 R?#71.3 R?#72.2 R?#72.3 R?#74.2 R?#74.3 R?#75.2 R?#75.3
+20V: C?#25.2 ESR.2
+24: R?#14.1
+24V: 10k.1 ?#1.1 ?#4.1 C?#4.2 C?#5.2 C?#16.2 C?#17.2 C?#23.2 D2#5.2(K) D?#1.2(K) D?#24.2(K) D?#30.2(K) L?#6.1 L?#6.2 L?#13.2 Q1#2.3(E) Q1#3.3(E) Q1#4.3(E) Q1#5.3(E) Q?#2.1(C) Q?#5.1(C) Q?#10.3(D) Q?#15.3(D) Q?#22.1(C) Q?#22.3(E) Q?#23.3(E) Q?#24.1(C) Q?#28.3(D) Q?#29.1(C) Q?#33.3(D) Q?#34.1(C) Q?#35.1(C) Q?#36.3(D) Q?#37.3(D) Q?#38.1(C) Q?#39.3(E) Q?#40.3(E) Q?#41.3(E) Q?#44.3(D) Q?#45.3(D) Q?#46.3(E) Q?#47.1(C) Q?#48.3(D) Q?#49.3(D) Q?#50.1(C) Q?#52.3(D) Q??.3(D) R1#1.1 R1#5.1 R1#6.1 R1#7.1 R1#8.1 R1#9.2 R1#9.3 R1#10.1 R1#11.2 R1#11.3 R?#1.1 R?#29.2 R?#29.3 R?#35.2 R?#35.3 R?#37.1 R?#40.1 R?#44.1 R?#48.1 R?#52.1 R?#53.1 R?#63.1 R?#64.1 R?#73.2 R?#73.3
+36V: 15V.1(A) ?#5.1 C?#1.2 C?#2.2 C?#3.2 C?#4.1 C?#5.1 C?#6.1 C?#7.1 C?#8.1 C?#10.1 C?#11.1 C?#12.1 C?#13.2 C?#14.2 C?#15.2 C?#16.1 C?#17.1 C?#18.1 C?#19.1 C?#21.1 C?#22.1 C?#23.1 C?#24.1 C?#25.1 C?#26.1 C?#27.1 C?#29.1 D1#2.1(A) D1#3.1(A) D1#4.1(A) D1#5.1(A) D?#2.1(A) D?#3.1(A) D?#4.1(A) D?#5.1(A) D?#6.1(A) D?#9.1(A) D?#12.1(A) D?#19.2(K) D?#20.2(K) D?#21.1(A) D?#23.1(A) D?#26.1(A) D?#27.1(A) D?#28.1(A) D?#29.1(A) D?#30.1(A) D?#31.1(A) D?#32.1(A) D?#33.1(A) ESR?.2 L?#4.1 Q2#1.3(E) Q2#2.3(E) Q2#3.3(E) Q2#4.3(E) Q?#6.3(E) Q?#8.3(E) Q?#10.1(G) Q?#15.1(G) Q?#17.1(G) Q?#21.3(E) Q?#28.1(G) Q?#33.1(G) Q?#36.1(G) Q?#37.1(G) Q?#44.1(G) Q?#45.1(G) Q?#46.2(B) Q?#48.1(G) Q?#49.2(S) Q??.1(G) R1#4.2 R2#1.2 R2#2.1 R2#3.1 R2#4.1 R2#6.1 R57.2 R?#2.1 R?#3.1 R?#4.1 R?#5.1 R?#6.1 R?#10.2 R?#16.1 R?#17.2 R?#24.2 R?#25.2 R?#26.1 R?#27.1 R?#28.1 R?#30.1 R?#32.1 R?#33.1 R?#35.1 R?#38.1 R?#39.1 R?#41.1 R?#42.1 R?#43.1 R?#45.1 R?#46.1 R?#47.1 R?#49.1 R?#50.1 R?#51.1 R?#54.1 R?#55.1 R?#57.1 R?#58.1 R?#60.1 R?#62.1 R?#65.1 R?#66.1 R?#67.1 R?#68.1 R?#69.1 R?#70.1 R?#71.1 R?#72.1 R?#73.1 R?#74.1 R?#75.1 V?.2  [also labelled GND]
+40v: R?#11.2 R?#12.2
VCC: D?#19.1(A) D?#20.1(A) D?#22.2(K) Q?#6.1(C) Q?#9.3(D) Q?#11.3(E) Q?#12.3(E) R1#2.1 R?#15.1 R?#20.1 R?#21.1  [also labelled VCC1]
VCC_1: ?#2.2
VIN: Q?#3.3(D) Q?#4.3(D)
VOUT: C?#6.2 C?#7.2 L?#1.2 L?#2.2 R?#3.2 R?#3.3 R?#4.2 R?#4.3
Vref: Q?#11.1(C) Q?#13.1(C) Q?#16.1(C) R?#19.2 R?#23.3
浮地: C?#28.2 D?#33.2(K) L?#16.1 Q?#52.2(S)
Net10k_2: 10k.2 D?#29.2(K) Q?#47.2(B)
Net?#1_2: ?#1.2 D?#5.2(K) Q?#5.2(B)
Net?#2_1: ?#2.1 C?#8.2 L?#3.2
Net?#4_2: ?#4.2 D?#21.2(K) Q?#34.2(B)
Net?#5_2: ?#5.2 D?#22.1(A)
Net?#6_1: ?#6.1 Q?#37.2(S)
NetC?#3_1: C?#3.1 D?#2.2(K) Q?#2.2(B) R?#1.2
NetC?#15_1: C?#15.1 D?#23.2(K) Q?#35.2(B) R?#48.2
NetC?#20_1: C?#20.1 R?#56.2
NetC?#20_2: C?#20.2 L?#9.1
NetC?#26_2: C?#26.2 ESR.1
NetC?#27_2: C?#27.2 ESR?.1
NetD1#1_1: D1#1.1(A) D2#1.1(A)
NetD1#2_2: D1#2.2(K) Q1#2.2(B) Q2#1.1(C) R1#8.2
NetD1#3_2: D1#3.2(K) Q1#3.2(B) Q2#2.1(C) R?#44.2
NetD1#4_2: D1#4.2(K) Q1#5.2(B) Q2#4.1(C) R?#52.2
NetD1#5_2: D1#5.2(K) Q1#4.2(B) Q2#3.1(C) R?#53.2
NetD2#2_1: D2#2.1(A) Q2#1.2(B)
NetD2#3_1: D2#3.1(A) Q2#2.2(B)
NetD2#4_1: D2#4.1(A) Q2#3.2(B)
NetD2#5_1: D2#5.1(A) Q2#4.2(B)
NetD?#3_2: D?#3.2(K) L?#1.1 Q?#3.2(S)
NetD?#4_2: D?#4.2(K) L?#2.1 Q?#4.2(S)
NetD?#6_2: D?#6.2(K) L?#3.1 Q?#9.2(S)
NetD?#9_2: D?#9.2(K) R?#36.1 R?#37.2
NetD?#10_2: D?#10.2(K) D?#11.2(K)
NetD?#12_2: D?#12.2(K) Q?#29.2(B) R1#7.2
NetD?#13_1: D?#13.1(A) D?#18.1(A)
NetD?#14_1: D?#14.1(A) D?#16.1(A)
NetD?#15_1: D?#15.1(A) D?#17.1(A)
NetD?#24_1: D?#24.1(A) Q?#42.2(B) R?#66.2
NetD?#25_1: D?#25.1(A) Q?#43.2(B)
NetD?#25_2: D?#25.2(K) R?#61.1
NetD?#26_2: D?#26.2(K) Q?#40.2(B) Q?#42.1(C) R?#63.2
NetD?#27_2: D?#27.2(K) Q?#41.2(B) Q?#43.1(C) R?#64.2
NetD?#28_2: D?#28.2(K) L?#11.1 Q?#45.2(S)
NetD?#31_2: D?#31.2(K) L?#12.1 Q?#48.2(S)
NetD?#32_2: D?#32.2(K) R1#10.2 R2#5.1
NetL?#7_1: L?#7.1 Q?#33.2(S)
NetL?#8_1: L?#8.1 Q?#36.2(S)
NetL?#10_1: L?#10.1 Q?#44.2(S)
NetQ?#6_2: Q?#6.2(B) R1#3.2
NetQ?#7_3: Q?#7.3(E) R1#4.1
NetQ?#8_1: Q?#8.1(C) R1#2.2
NetQ?#11_2: Q?#11.2(B) R?#18.2
NetQ?#12_1: Q?#12.1(C) R?#19.1
NetQ?#13_3: Q?#13.3(E) R?#15.2
NetQ?#14_3: Q?#14.3(E) R?#24.1
NetQ?#16_3: Q?#16.3(E) R?#20.2
NetQ?#22_2: Q?#22.2(B) R?#36.2
NetQ?#24_2: Q?#24.2(B) R?#40.2
NetQ?#42_3: Q?#42.3(E) R?#65.2
NetQ?#43_3: Q?#43.3(E) R?#68.2
NetQ?#50_2: Q?#50.2(B) R2#5.2
NetR57_1: R57.1 V?.1
NetR?#7_2: R?#7.2 R?#10.1
NetR?#8_2: R?#8.2 R?#11.1
NetR?#9_2: R?#9.2 R?#12.1
NetR?#13_2: R?#13.2 R?#14.2 R?#17.1
NetR?#21_2: R?#21.2 R?#23.1
NetR?#22_3: R?#22.3 R?#25.1
NetR?#31_3: R?#31.3 R?#33.3

Not connected (* = marked no-connect by the designer): ?#3 1 2; C?#9 1; C?#30 1 2; C?#31 1 2; C?#32 1 2; C?#33 1 2; C?#34 1 2; C?#35 1 2; C?#36 1 2; C?#37 1 2; C?#38 1 2; D1#1 2(K); D2#1 2(K); D?#7 1(A) 2(K); D?#8 1(A) 2(K); D?#10 1(A); D?#11 1(A); D?#13 2(K); D?#14 2(K); D?#15 2(K); D?#16 2(K); D?#17 2(K); D?#18 2(K); L?#5 1 2; L?#9 2; L?#14 1 2; L?#15 1 2; Q1#1 1(C) 2(B) 3(E); Q?#1 1(G) 2(S) 3(D); Q?#3 1(G); Q?#4 1(G); Q?#9 1(G); Q?#17 3(D); Q?#18 1(C) 2(B) 3(E); Q?#19 1(C) 2(B) 3(E); Q?#20 1(C) 2(B) 3(E); Q?#21 2(B); Q?#23 2(B); Q?#25 1(C) 2(B) 3(E); Q?#26 1(C) 2(B) 3(E); Q?#27 1(C) 2(B) 3(E); Q?#30 1(C) 2(B) 3(E); Q?#31 1(C) 2(B) 3(E); Q?#32 1(C) 2(B) 3(E); Q?#38 2(B); Q?#39 2(B); Q?#49 1(G); Q?#51 1(C) 2(B) 3(E); R?#22 2; R?#23 2; R?#31 2; R?#33 2; R?#34 1 2 3; R?#56 1; R?#59 1 2 3

## Notes on the sheet
- 电路分析基础方法：
- 低压差：
- 低压差线性稳压电路(LDO)
- LDO的输入与输出的压差不能太大
- 反馈
- (near D?#1) 防止出现反向电流
- BUCK电路数学理论分析（CCM模式）
- BOOST
- （1）设计的三要素：源、回路、阻抗
  （2）节点分析法：节点电压、节点电流、节点内阻
  （3）电流钳位法：大电流钳位小电流
- 线性：
- 稳压：
- 输入输出俩端的电压和电流成正比
- 设计的电路输出电压要是稳定的
- AM
- 补充：NPN型三极管作为开关管使用常用来接地
  PNP型三级管作为开关管使用常用来接源
- 过欠压保护：输入15V到导通，10V截止（先了解滞回比较器）
- 施密特触发器
- BUCK开关电源拓扑推导
- MOS管打开
- （1）设计的三要素：源、回路、阻抗
- 反馈:将输出结果与AF系数相乘，并与输入端相加（相减）
- 要求：
  电路大于15V导通
  电路小于10V关断
- 为什么要设计两个电压阈值?为什么要采用电压滞回?
- (near L?#2) V
- (near L?#2) L
- 注意：一条电路里面需要同时包含源、阻抗，并且形成一条完整的回路
- (near R57) 源：提供电路所需能源
- AF
- 对于NPN三极管是不是需要把输出（发射级）与输入（基极）做文章
- 将输出的一部分能够影响输入的变化
- 模拟滤波
- RC滤波（信号）
- LC滤波(功率)
- (near C?#6) V
- (near C?#6) C
- (near R57) 回路：从源到地的电流路径
- (near R57) 阻抗：回路中等效电阻
- 三极管的Veb压差不能大于一定范围
- （2）节点分析法：节点电压(KVL)、节点电流(KCL)、等效内阻
- 数字滤波
- 斯密特触发器
- 为什么要使用开关电源？
- 原因：线性电源简单，但是效率低
- BUCK电路电感分析与选型
- (near L?#3) BUCK基本结构
- Vin-Vo
- -Vo
- 电压
- 电流
- V
- L
- di
- dt
- Vin - Vo
- （充电电流斜率）
- (near R?#7) 6V
- (near R?#8) 12V
- (near R?#9) 40V
- 节点电压：该节点连接到不同器件的一端具有相同的电压值
- 方案一
- (near R1#4) 方案二
- 方案三
- (near ?#2) 负载电阻
- △i
- - Vo
- MOS管关闭
- 节点电流：该节点流入的电流等于流出的电流
- 方案一:Vb↑—》Ib↑—》Ic↑
- 哪个形成了负反馈
- 什么是模拟电路?
  什么是数字电路?
  我们整个世界是什么世界?是数字世界还是模拟世界?
  我们整个世界都是模拟的，那么为什么我们还说数字电路呢?模拟世界是本质，数字电路只不过是一个特殊的模拟状态而已什么意思?
  我们人为进行了划分，当模拟的东西速度达到一定值之后我们就可以认为是数字电路了你认为的数字电路其实并不是数字电路，整个世界没有纯正的数字电路
  只不过都是相对的，相对而言，我的速度达到了一定的高度之后我就可以定义为数字电路了举例说明:
- 伏秒平衡：电感开通时电压*开通时间 = 电感关断时电压 *关闭时间
- （放电电流斜率）
- 方案三:Vb↑—》Ib↑—》Ic↑—》Vc↓（集电极电阻压降增大，Vc = VCC - Ic*Rc）
- 请问方案二中IC的最大电流是多大？
- 方案二:Vb↑—》Ib↑—》Ic↑—》Ve↑—》Vbe↓—》Ib↓—》Ic↓
- ON
- 电感上电稳定
- OFF
- 时间
- 已知输入输出电压，求开关占空比
- IL（T）-IL（0）
- 1
- 0
- Ts
- {（Vin - Vo）*Ton - Vo * Toff  }
- Ton
- （3）电流钳位法：大电流钳位小电流
- 静态电流由基极电压和发射极电阻决定
- Ie =
- 5.7V - Vbe
- R1
- 电阻不变，电流恒定
- 在大多数低压降稳压器 (LDO) 中，电流沿特定方向流动，电流
  方向错误会产生重大问题！反向电流是指从 VOUT 流向 VIN 而不
  是从 VIN 流向 VOUT 的电流。这种电流通常会穿过 LDO 的体二
  极管，而不会流过正常的导电通道，有可能引发长期可靠性问
  题甚至会损坏器件
- 理想的方波
- 我们由低压差线性稳压电源结构可得，降压需要一个开关和负载
- （Vin - Vo）*Ton - Vo * Toff  = 0
- 已知开关频率，求开关导通和关闭的时间
- ton
- toff
- Toff
- Vo
- 左火右零
- 但是我们发现我们mos管也有3个阶段：截止、放大、饱和
- 如果我们使用放大区，其效果和三极管一样，源内阻较大
- 2△i
- 电感上电流纹波大小
- T
- Don
- 已知留出电感的电流：
- I
- 电容
- C
- +
- 负载
- O
- (near R?#17) 节点A
- 橡胶鞋
- 人
- 在输出和输入之间使用肖特基二极管可以在输出
  电压超过输入电压时防止 LDO 中的体二极管导通。您必须使
  用肖特基二极管，肖特基二极管的正向电压较低，而传统二极
  管的正向电压与肖特基二极管相比要高得多。在正常工作中，
  肖特基二极管会进行反向偏置，不会传到任何电流。此方法的
  另一项优势是，在输出和输入之间放置肖特基二极管后，LDO
  的压降电压不会增大。
- 相对实际的方波
- 上升时间 = 斜率 + 电压阈值
- 带有上升沿和下降沿
- 所以我们只使用mos管饱和、截止状态，其源内阻小
- 电感电流初始状态
- 已知输入输出和电流纹波大小，求电感L值
- 输出到输入没有接二极管，输出轻载，输入重载断电后的波形。
- 输入
- 输出到输入接二极管，输出轻载，输重载断电后的波形。
- 输出
- 电感电流的纹波跟负载电流的大小没有关系
- 开关工作CCM模式分析
- 回路中谁的电阻小，该节点的电压就听从谁的
- 电流 == 内阻 ===》回路中电阻越小，电流的驱动能力就越强
- 由于50hz工频干扰和其他外部电磁干扰，实际方波上会有波动
- 实际的方波
- 问题1：如果打开开关输出也会是20V电压，关闭开关输出电压为0V
- CCM模式是开关电源中电感电流在整个开关周期内始终不为零的工作模式
- 断续导通模式（DCM）这不是我们想要的
- 由于BUCK电路，电感有上下纹波△I，当电流大小小于纹波大小时，会出现断续导通模式（DCM）
- 设计：24V输入==》15V输出
- (near R?#19) 方案二
- 同时在电压上升和下降过程会发生震荡,通过FFT进行频谱分析得到是不同频率的正弦波叠加
- 2.9V
- Ic
- 最小电流要大于一半的纹波电流
- min
- -
- >
- 2L
- 假设负载电阻和源内阻不变化，通过电阻分压可得
- V =
- R2
- 方案二:Vb↑—》Ib↑—》Ic↑—》Vc↑（对发射极级影响小）
- 方案三:Vb↑—》Ib↑—》Ic↑—》Ie↑—》Vbe↓—》Ib↓—》Ic↓
- 正常情况下的波形如加二极管上图，绿色是18V LDO输入），蓝色是15V ( LDO输出）
  正常情况下断电输入与输出基本上是同步放电，不存在异常现象。
- 0.8V
- 输出电流需要大于2倍的纹波电流
- 电流纹波比率:
- r
- 2*△i
- 100%
- (near R2#1) 由于前面提到的电流钳位法得到，当内阻小时电流的驱动能力较强
- R1 + R2
- 在负反馈电路中是处于放大状态还是饱和状态
- 此方法在 LDO 之前使用二极管以防电流流回到
  电源。这是一种防止出现反向电流的有效方法，但它也会增大
  防止 LDO 出现压降所需的必要输入电压。置于 LDO 输入端的
  二极管在反向电流条件下会变为反向偏置状态，不允许任何电
  流流过。
- 问题2:关闭开关输出电压为0V,如果让开关关闭的时候，输出电压不为0
- 电感电流波形
- 业内考虑电感的纹波率通常为：r ≤ 0.3
- 纹波率需要小于200%
- 2
- *
- 0.3
- 在 LDO 之前使用二极管
- 思考：为什么是2个阈值，不是一个阈值
  如果是0V上升到3.3V，震荡跌落到0.8V--3.3V之间，输出是什么
- 以GPIO上3.3V电压为例进行分析：
  低于0.8V的为低电平
  高于3.3V的为高电平
  中间0.8V-3.3V的电压为过渡态（缓冲区）
- 是不是需要一个储能器件
- 开关频率高
- 最终L电感取值范围（考虑输出电流最大的情况计算）：
- 2I
- 典型应用电路
- 根据电感上值计算电流纹波大小
- 1、可控
- 单阈值
- 实际使用ic会先有实际负载电流，根据这个选合适的ic，ic有固定的电流范围。
- 所以电感也是有最大耐压值，要大于最大峰峰值电流
- 电感越大,纹波电流越小，同时大感值电感会带来较大的封装尺寸
- 开关频率越高，纹波电流越小，同时提高开关频率会导致EMI恶化
- (near R?#29) 需要能自主的调节
- (near R?#30) 负载实时变化
- 2、等效于滑动变阻器器
- 3、能够随负载一起变化
- (near R?#24) 方案二
- 也可以正常进行预测，但是抗干扰能力弱，当出现干扰的时候，容易在阈值上下震荡，没有缓冲区，导致频繁开关
- 如果是0V上升到3.3V，震荡跌落到0.8V--3.3V之间，输出是什么
- 【饱和电流】电感的饱和电流要大于电感瞬时最大电流值（考虑感值恶化30%)
- 负载实时变化
- 前面提到三极管放大状态等效于可变电阻,是不是满足电阻分压
- 当开始输入为低变为高时，达到阈值输出变为3.3V
- 肯定还是想输出3.3V
- 电容：电压不突变，电流突变
- 电感：电压突变，电流不突变
- 【额定电流】电感的额定电流要大于流经电感电流的有效值lRMs(考虑器件温升)，即最大输出电流。
- 【DCR】同时考虑能量损失及发热，也希望选取DCR (ESR）更小的电感，可能需要在尺寸和DCR之间平衡。
- 当负载发生变化后，通过电阻分压可得，+15V供电电压会发生变化
- 是不是只要不处于饱和状态（相当于导线），是不是无法等于输入电压12V
- 输出信号低于3.3V时，输出还是高电平，除非信号能低于0.8V，才输出低电平
- 通过时序图可以发现，施密特触发器其实类似于中断的边沿触发，看似是高低电平判断，其实是先通过边沿触发，然后触发输出电平
- 开关频率低
- BUCK电路输出电容分析与选型
- 为了保证分压不变，则源内阻需要跟随负载电阻进行同时变化以保存分压正确
- 是不是只要我动态调整源电阻与负载电阻的分压可以保证输出电压恒定为15V
- T1
- 无输出电容
- 留出电感的电流和流入电容的电流趋势是一样的
- (near D?#7) 二极管
- 低阈值上存在干扰我是怎么处理的?
  高阈值上存在干扰我是怎么处理的?
  就是设定两条线，一条高阈值，一条低阈值
  那么低阈值上的干扰达不到设定的高阈值就不导通
  那么高阈值上的干扰达不到设定的低阈值就不导通
- 有输出电容
- 留出电感和负载的电压和电容的电压的是一致的
- 所有电容两端的纹波和负载两端的纹波是一样的
- (near D?#7) 不可控的开关
- (near Q?#19) 可受控制的开关
- (near Q?#19) 三极管
- 分析题：单片机里面的边沿触发和高低电平触发是不是使用了施密特触发器？
  他们的硬件实现逻辑的区别是什么？
- T2
- 电感两端电压变化
- 安秒平衡：电容充电*开通时间 = 电容关断时电流 *关闭时间
- dv
- （1）三级管
- 结合前面反馈和导通
- 设计：输入电压15V到导通，10V截止电路分析（欠压保护）
- 如果开关频率高，并且控制开关，输出电压会是多少？
- (T) -
- Q
- (0)
- Doff
- (near Q?#21) B
- (near Q?#21) C
- 0.7
- 方案一：使用NPN
- 方案二：使用PNP
- 上电：上电输入电压由0V上升15V才导通，不能上到10V就导通
  掉电：输入电压下降到10V时才断开
- 电感电流
- Io
- Uc2
- C * Uc
- Uc1
- Toff -
- Ton -
- (near Q?#21) E
- 三极管电流公式:Ic=β*Ib
  Ib:基极电流
  Ic:集电极电流
  Ie:发射极电流
  Ie=Ib+Ic
  Ic=β*Ib
  也就是说要想让三极管工作的话必须要有Ib电流
  有Ib电流才有Ic电流
  所以三极管才会被称为流控流型器件
- 流控流型器件的缺点:
- 流控流型器件导通条件需要同时具备导通电压（Ube = 0.7V）和Ib电流
- 通过将内部基准电压分压通过外部分压来实现
- 内部已经实现分压
- (near D?#8) 不可控的开关
- (near D?#8) 二极管
- 可受控制的开关
- (near Q?#20) 三极管
- △v
- vo
- 图中可以看到电容电压滞后于电流。
- 电容上电压纹波大小
- 初学认为“对信号进行放大”
- 流控流型器件的优点:
- 我们都知道集成电路中有成千上万个体管
  那么每个体管消耗的电流是1mA
  如果集成电路内部有1万个晶体管呢?是不是就消耗10A的电流
- (near R?#35) 分析：
  第一：如果不对15.7稳压管进行处理，是不是输入下降到15V时，系统是不是自己关闭了
- BUCK电路（CCM模式）
- 2△U
- Uc1 +
- C L
- {
- 三极管本质是控制外部的源对外输出电流的能力
- (near D1#1) （2）三级管的工作模式
- 由于输入是电流，那么我就可以通过改变电流的大小
  来提高抗干扰能力
- (near R?#39) 负载实时变化
- (near R?#38) 负载实时变化
- 第四：是不是需要有一个可以控制的开关实现10V的控制和间接控制15V的关闭
- 第二：上电时，15V稳压管起作用，上电成功后，需要15V稳压管没有作用
- 第三：掉电的时候后，10V稳压管发挥了作用
- 问题3：目前电压波形需要克服电流突变问题
- (near ?#3) 需要使用一个器件：能够抑制电流突变
- 电容值越大，输出纹波越小，同时大容会带来较大的封装尺寸和成本;
- 开关频率越高,输出电压纹波越小，同时提高开关频率会导致EMI恶化。
- (near Q1#1) C
- (near Q1#1) P
- (near D1#1) P
- (near Q?#26) NPN:电流两进一出
- (near Q?#25) PNP:电流两出一入
- 形成负反馈，处于放大状态，等效为可调电阻
- 处于饱和状态，等于一条直线
- 上电
- 正常
- 15V
- 关闭
- 打开
- 10V
- (near ?#3) 电阻
- I =
- R
- 当R确定时，通过的最大电流就确定了（电阻限流）
- BUCK电路数学理论分析（DCM模式）
- (near Q1#1) B
- (near Q1#1) N
- (near Q1#1) E
- N
- (near D2#1) P
- (near Q?#26) Ib
- (near Q?#26) Ie
- (near Q?#26) Ic
- (near Q?#25) Ib
- (near Q?#25) Ie
- (near Q?#25) Ic
- 从中得到启发：LDO的本质就是三极管等于于可调电阻与负载进行分压，维持电压恒定
- 三极管等效与电阻，那么他的输出电流能力有限，多余的电压需要LDO本身承担
- 再次上电
- 掉电
- (near L?#5) 电感
- 电感有电流不突变，电压可以突变特性
- P
- OVER LOAD
- 2者相反
- (near Q?#27) E
- (near D?#10) P
- (near Q?#26) 晶体管各个端子的电流关系
- 咱先使用电阻限流分析
- Pmax
- (near Q?#27) B
- (near Q?#27) P
- (near Q?#27) C
- (near Q?#27) N
- (near D?#10) N
- (near D?#11) P
- (near D?#10) 基极电压 > 发射极电压 (Vb > Ve)
  通常 Vbe ≥ 0.7V
- 发射极电压 > 基极电压 (Ve > Vb)
  通常 Veb ≥ 0.7V
- 如果我的输入电压为100V会怎么样？
- 那85V的电压是不是要由LDO承担，发热就会严重
- 设计：输入15V到导通，10V截止电路实现思路分析
- (near L?#6) ③
- (near Q?#28) ②
- (near Q?#28) ①
- (near C?#11) ⑤
- ④
- Short
- 当电压恒定时，功率的上升代表着工作的并联器件增加了，并联电阻增加后，等效电阻减小，导致电流增大
- 注意：当功率很小时时，电流就会很小，我们在上面推导发现，我们是有电流纹波大小的
- Rmin
- 2Rmin
- 0.5Rmax
- Rmax
- (near Q?#31) N
- (near Q?#31) P
- (near D?#14) P
- (near Q?#32) N
- (near Q?#32) P
- (near D?#15) P
- (near Q?#30) N
- (near Q?#30) P
- (near D?#13) P
- 当电流小于电流纹波大小的一半时，电感电流为0时，电容反向给电感充电，会产生反向的电流
- 思考：我加入了正向导通电压，能不能通过反向电流
- (near D?#16) P
- (near D?#17) P
- (near D?#18) P
- 如果使用电阻，放到1位置上
- 满足了导通压降
- 发射极反偏，集电极反偏（截止）
- 发射极正偏，集电极反偏（放大）
- 发射极正偏，集电极正偏（饱和）
- 为什么使用一大一小电容
- (near D?#19) I
- (near D?#20) I
- - - - - -
- 耗尽区
- P区
- I1
- (near R?#47) I2
- 阴离子流动
- (near D?#19) 阴离子流动
- + + + + +
- N区
- BUCK电路（DCM模式）
- 截止状态下，集电极与发射极之间是不导通的，
  相当于开关的断开。
- 放大状态下，电流ic的大小受电流ib控制，三极管等效一个可调电阻来控制源端输出电流
- 上电时，10V控制的Q2三级管不导通
- 上电时，15V控制的Q1三级管导通
- 稳定时，10V控制的Q2三级管导通导通，D1被Q2短路
- 正常工作时：加了正向电压，二极管导通，电流必定是正向的
  （从阳极流向阴极），绝不会出现反向电流。
- 正向电流：指电流从阳极流向阴极。
  反向电流：指电流从阴极流向阳极
- 求负载电阻
- 注意：二极管在使用使用时，不是理想的，会有反向漏电流
- 三极管本质是控制外部的源对外输出电流的能力==》等效于可调电阻改变源端对外驱动电流的能力
- 电感电压
- CCM:
- <
- DCM:
- 将R1使用三级管代替
- 思考：为什么使用输入输出电容
- 第三：除了限流外，没有功耗
- Td1
- Td2
- IL(T) - IL(0)
- { (Vin - Vo)*Ton + (- Vo)  *  Td1  + Td2 * 0 }
- 容抗公式：
- 因为EMC主要的干扰都是高频干扰，而小电容就是滤除高频干扰的
  如果小电容不靠近芯片供电引脚的话，那中间的一段距离是不是有可能会引入高频干扰所以大家在PCB布局的时候一定要让小电容靠近芯片的供电引脚
- 思考：为什么小电容滤高频，大电容滤低频？
- R =
- JWC
- ω = 2πf
- 理论上电容值越大，阻抗越低，频率越高越容易通过
- 实际的电容模型：
- {（Vin - Vo）*Ton - Vo * Td1 - 0 *Td2  }
- Rc =   R + JWL +
- (
- WL +
- WC
- 输出电压下降到10V时，Q2断开，系统供电结束
- 思考：如果我把D2连接到PNP三极管的集电极是否能实现
- 在开关打开时，给电感充电，储存能量；关闭时，能够为电容供电
- 电感是储能器件，不消耗能量，同时抑制充电电流突变
- 电容电流
- (near R?#57) 负载实时变化
- (near R?#58) 负载实时变化
- 为了Rc最小，需要求谐振频率W
- X =   WL +
- W =
- LC
- 电感是储能器件，不消耗能量，电压可以突变，电流不能突变
- 思考：剩下的7V压降到哪些去了？
- 电容电压
- 其中一套方案是不可行的
- （1） W > Wo , 呈现感性，电压超前
- （2） W < Wo , 呈现容性，电流超前
- 阻抗随频率变化规律：
- 平均电压是15V
- 阻抗
- 问题三：是不是开关打开能形成回路，关闭是不是没有形成回路
- 开关S关闭期间，若电感储存能量释放完而下一周期开关S导通信号未到，则电感L电流为0,二极管截止，负载电流仅靠电容C维持。
- 开关S闭合期间，电感L与电容C上的电压电流与连续情况Buck-Boost电路工作状态一致;开关S断开后
- 使用PNP三极管一直导通.15V变为24V
- 容性
- 感性
- 使用PNP三极管处于饱和状态（后面会解释）
- Wo
- 频率
- (near R?#67) 负载实时变化
- 是否能使三极管处于放大状态？
  三极管处于放大状态时等效于可变电阻
- 大容量的电容由于制造工艺限制存在比较大的电感，
  所以滤高频波反而用小电容；
  滤低频波用大电容主要是为了负载的电流足够和纹波足够小
- 思考：为什么使用一大一小电容并联滤波
- 电容波形分析
- 二极管作用：将基极电压钳位为15.7V
  10K电阻起到限流导通的作用
- 16mA
- 18mA
- 20mA
- 20V
- 16V
- 18V
- BUCK&&BOOST
- (near 10k) I1
- 节点A
- 使用NPN三极管处于放大状态（后面会解释）
- 大电容
- 小电容
- W1
- 14mA
- 12mA
- 10mA
- 8mA
- 12V
- 14V
- 8V
- BUCK
- 当从小电流跳跃到大电流时，电感来不急反应，多余的电流是由电容提高，输出电压上能看到负过充；
  当电压从大电流跳跃到小电流时，电感上电流不能突变，多余的电流将流入电容，在输出电压能看到一个正过充。
  通过将电容容值进行加大，能将过充减少，但是会加大成本和面积；电感对这个过充也是有影响的，电感值越大，动态效应越差。
- 为什么输出是15V，能够调整放大状态使输出电压达到24V
  是否能使三极管处于饱和状态？
  三极管处于饱和状态时等效于导线
- 不同电容值的电容所处的谐振频率不同，能够提高整体的滤波频率带宽
- 2mA
- 4mA
- 6mA
- 0mA
- 0V
- 2V
- 4V
- 6V
- 应用案例介绍
- 详细的LDO内部框图
- -2mA
- -4mA
- -6mA
- -2V
- -4V
- -6V
- t
- -10mA
- -12mA
- -14mA
- -8mA
- -10V
- -14V
- -12V
- -8V
- -16mA
- I = C
- -16V
- 电容两端的压差越大，流入流出电流越大，充电斜率越大
- 第一：开关使用mos管，我需要降压，肯定需要储能，并且控制开关的开关频率
- 可以按照上面的思路搭建BOOST电路
- 10K电阻起到限流导通的作用
  是选择R1位置还是R2位置？
  R1限制的主电流供电路径，R2只是限制了支路电流
  使用R1进行限流后，就不需要使用R2进行限流了
- 3、电容充电到10V时，电容两端的压差为10V，剩余10V电压全部在电阻上
- 1、电容充电到0V时，电容两端的压差为0V，剩余20V电压全部在电阻上
- 2、电容充电到5V时，电容两端的压差为5V，剩余15V电压全部在电阻上
- (near C?#26) 0V
- (near C?#26) 20V
- (near C?#27) 0V
- 第二：电容有电流突变，我需要抑制电流突变
- 第三：形成闭合回路
- 这是我们常用的芯片外围电路
- 使用NPN实现15V输出的上电，稳态、关机时的分析
- PNP为什么不能实现类似于可调电阻分压
- 2、电容充电到15V时，电容两端的压差为15V，剩余5V电压全部在电阻上
- BUCK转换器能量转换
- 这是芯片内部框图与外部电路
- ON TIME
- OFF TIME
- 我们从输入看内部内部有许多结构，但是这咱们先不管，后面会进行介绍
- 我们先观察和我们外部电路器件有关的电路部分
- 反馈引入
- LDO内部基本都是由4大部件构成，分别是分压取样电路、基准电压、误差放大电路和晶体管调整电路
- INPUT
- OUTPUT
- 为什么要使用自举电容呢？
- 首先是输入部分，这部分输入后会给内部电路供电
- BOOT引脚：连接了一个电容,这个是一个自举电容，利用自举电容2端的电压差不能变化的特性
- 分压取样电路---通过电阻R1和R2对输出电压进行采集
- 误差放大电路---将采集的电压输入到比较器反向输入端
- (near L?#14) STORAGE
- (near L?#15) STORAGE
- 自举电容就可以使MOS管的源极电压低于栅极电压
- 是因为我们使用的是NMOS管驱动，必须栅极电压高于基极电压
- 晶体管调整电路---把这个放大后的信号输出到晶体管的控制极（也就是PMOS管的栅极或者PNP型三极管的基极）
- 与正向输入端的基准电压（也就是期望输出的电压）进行比较，再将比较结果进行放大
- 从而这个放大后的信号（电流）就可以控制晶体管的导通电压了，这就是一个负反馈调节回路
- (near C?#28) 24v+15V
- (near Q?#51) 可变电阻
- (near Q?#51) 负载实时变化
- 稳态时整体流程：当输出电压升高时，取样电路的分压点电压升高，误差放大器反向端电压比同向端高
- 误差放大器输出电流减小，由于我们LDO输出端是使用三极管分压，三极管处于放大区间
- FB引脚：这个引脚链接内部的误差放大器，FB引脚的电压固定在1.265V（内部带隙基准电压）
- SW引脚：这个引脚连接MOS管输出电压，对应BUCK电路里面的开关MOS管
- EN是系统启动引脚：这个就没啥好说的
- 当FB引脚电压比基准电压高了时，控制PWM输出占空比下降，减小输出电压
- (near C?#28) 自举电容
- (near C?#28) PWM
- (near Q?#52) Q1
- 要求MOS管处于放大状态并且能够自动调节
- 三极管的基极是连接误差放大器的输出端，所以当误差放大器的输出电流减小时，三极管的等效电阻增大
- 最终输出电压降低，取样电路的电压等于基准电压
- (near C?#28) 24v
- (near Q?#52) 节点A
- (near D?#33) 100V
- 2、是不是需要保证三极管能够处于放大，避免饱和状态
- 1、是不是需要引入反馈，首先能够R2变化导致R1（三极管放大状态）的电阻变化
- 正反馈？？负反馈
- (near C?#30) 112V
- (near D?#33) Q2
- (near C?#34) 12V
- (near C?#31) 100V
- (near C?#34) 压差12V
- (near C?#34) 0V
- 自举电容比喻
- 自举电容就类似一艘船，随着水平面上升
- 水涨船高
- (near C?#36) GS压差
- (near C?#35) GS压差
- (near C?#35) 12V
- (near C?#36) 12V
- (near C?#37) GS压差
- (near C?#38) GS压差
- (near C?#37) 12V
- (near C?#38) 12V

## Library data of the parts
10k ?#1-?#6 ESR ESR? R1#1-R1#8 R1#10 R2#1 R2#5 R57 R?#1 R?#7-R?#15 R?#17-R?#21 R?#24 R?#25 R?#36 R?#37 R?#40 R?#44 R?#48 R?#52 R?#53 R?#61 R?#63-R?#66 R?#68 = Resistor: TC1: 0; SimulationGenericComponent: True; TC2: 0
C?#1-C?#19 C?#21-C?#27 C?#29 = Capacitor: SimulationGenericComponent: True
C?#20 = Capacitor: SimulationGenericComponent: True; Value: 1p
D1#2-D1#5 D2#2-D2#5 D?#1-D?#6 D?#9 D?#12 D?#19-D?#33 = 1N4148W_C7420318: Symbol: 1N4148W_C7420318
L?#1-L?#8 L?#10-L?#16 = Inductor: SimulationGenericComponent: True
L?#9 = Inductor: SimulationGenericComponent: True; Value: 1u
Q1#1 Q2#1-Q2#4 Q?#2 Q?#5-Q?#8 Q?#14 Q?#18-Q?#21 Q?#24 Q?#26 Q?#29-Q?#32 Q?#34 Q?#35 Q?#38 Q?#42 Q?#43 Q?#47 Q?#50 Q?#51 = BJT NPN VBIC: SimulationGenericComponent: True; AFN: 1; AJC: -0.5; ART: 0.1; AVC1: 0; EA: 1.12; FC: 0.9; IBBE: 1e-06; IBCI: 1e-16; IBEI: 1e-18; MC: 0.33; NCN: 2; NKF: 0.5; PC: 0.75; TNOM: 27; VERS: 1.2; XII: 3; AJE: -0.5; AJS: -0.5; AVC2: 0; BFN: 1; CBCO: 0; CBEO: 0; CCSO: 0; CJC: 0; CJCP: 0; CJE: 0; CJEP: 0; CTH: 0; DEAR: 0; EAIC: 1.12; EAIE: 1.12; EAIS: 1.12; EANC: 1.12; EANE: 1.12; EANS: 1.12; EAP: 1.12; EBBE: 0; GAMM: 0; HRCF: 1; IBCIP: 0; IBCN: 0; IBCNP: 0; IBEIP: 0; IBEN: 0; IBENP: 0; IKF: 0; IKP: 0; IKR: 0; IS: 1e-16; ISP: 0; ISRR: 1; ITF: 0; KFN: 0; ME: 0.33; MS: 0.33; NBBE: 1; NCI: 1; NCIP: 1; NCNP: 2; NEI: 1; NEN: 2; NF: 1; NFP: 1; NR: 1; PE: 0.75; PS: 0.75; QBM: 0; QCO: 0; QTF: 0; RBI: 0.1; RBP: 0.1; RBX: 0; RCI: 0.1; RCX: 0; RE: 0; RS: 0; RTH: 0; TAVC: 0; TD: 0; TF: 0; TNBBE: 0; TNF: 0; TR: 0; TVBBE1: 0; TVBBE2: 0; VBBE: 0; VEF: 0; VER: 0; VO: 0; VREF: 0; VRT: 0; VTF: 0; WBE: 1; WSP: 1; XIKF: 0; XIN: 3; XIS: 3; XISR: 0; XRBI: 0; XRBP: 0; XRBX: 0; XRCI: 0; XRCX: 0; XRE: 0; XRS: 0; XTF: 0; XVO: 0
Q1#2-Q1#5 Q?#11-Q?#13 Q?#16 Q?#22 Q?#23 Q?#25 Q?#27 Q?#39-Q?#41 Q?#46 = BJT PNP GP: BF: 100; AF: 0; BR: 1; EG: 1.11; FC: 0.5; IS: 1e-16; MJC: 0.33; NC: 2; NE: 1.5; TNOM: 27; VBC_MAX: 1e99; VJC: 0.75; XTI: 3; SimulationGenericComponent: True; CJC: 0; CJE: 0; CJS: 0; CTC: 0; CTE: 0; CTS: 0; IKF: 0; IKR: 0; IRB: 0; ISC: 0; ISE: 0; ISS: 0; ITF: 0; KF: 0; MJE: 0.33; MJS: 0; NF: 1; NKF: 0.5; NR: 1; NS: 1; PTF: 0; RB: 0; RBM: 0; RC: 0; RE: 0; SUBS: 1; TBF1: 0; TBF2: 0; TBR1: 0; TBR2: 0; TF: 0; TIKF1: 0; TIKF2: 0; TIKR1: 0; TIKR2: 0; TIRB1: 0; TIRB2: 0; TIS1: 0; TIS2: 0; TISC1: 0; TISC2: 0; TISE1: 0; TISE2: 0; TITF1: 0; TITF2: 0; TLEV: 0; TLEVC: 0; TMJC1: 0; TMJC2: 0; TMJE1: 0; TMJE2: 0; TMJS1: 0; TMJS2: 0; TNC1: 0; TNC2: 0; TNE1: 0; TNE2: 0; TNF1: 0; TNF2: 0; TNR1: 0; TNR2: 0; TNS1: 0; TNS2: 0; TR: 0; TRB1: 0; TRB2: 0; TRC1: 0; TRC2: 0; TRE1: 0; TRE2: 0; TRM1: 0; TRM2: 0; TTF1: 0; TTF2: 0; TTR1: 0; TTR2: 0; TVAF1: 0; TVAF2: 0; TVAR1: 0; TVAR2: 0; TVJC: 0; TVJE: 0; TVJS: 0; VAF: 0; VAR: 0; VBE_MAX: 1e99; VCE_MAX: 1e99; VJE: 0.75; VJS: 0.75; VTF: 0; XCJC: 1; XTB: 0; XTF: 0
R1#9 R1#11 R2#2-R2#4 R2#6 R?#2-R?#6 R?#16 R?#22 R?#23 R?#26-R?#35 R?#38 R?#39 R?#41-R?#43 R?#45-R?#47 R?#49-R?#51 R?#54 R?#55 R?#57-R?#60 R?#62 R?#67 R?#69-R?#75 = 3296W-1-103_C48997937: Symbol: 3296W-1-103_C48997937
R?#56 = Resistor: TC1: 0; SimulationGenericComponent: True; Value: 1K; TC2: 0
V? = Battery: SimulationGenericComponent: True
15V D1#1 D2#1 D?#7 D?#8 D?#10 D?#11 D?#13-D?#18 = 1N4148W_C7420318: Symbol: 1N4148W_C7420318
C?#28 C?#30-C?#38 = JVJ50V100M6X8: Symbol: JVJ50V100M6X8
Q?#1 Q?#3 Q?#4 Q?#9 Q?#10 Q?#15 Q?#17 Q?#28 Q?#33 Q?#36 Q?#37 Q?#44 Q?#45 Q?#48 Q?#49 Q?#52 Q?? = 2N7002,215: Symbol: 2N7002,215